# EAGLE design ELRS_USB_TX (EAGLE 9.7.0)

## Sheet 1 of 5: USB-C, protection and USB-UART
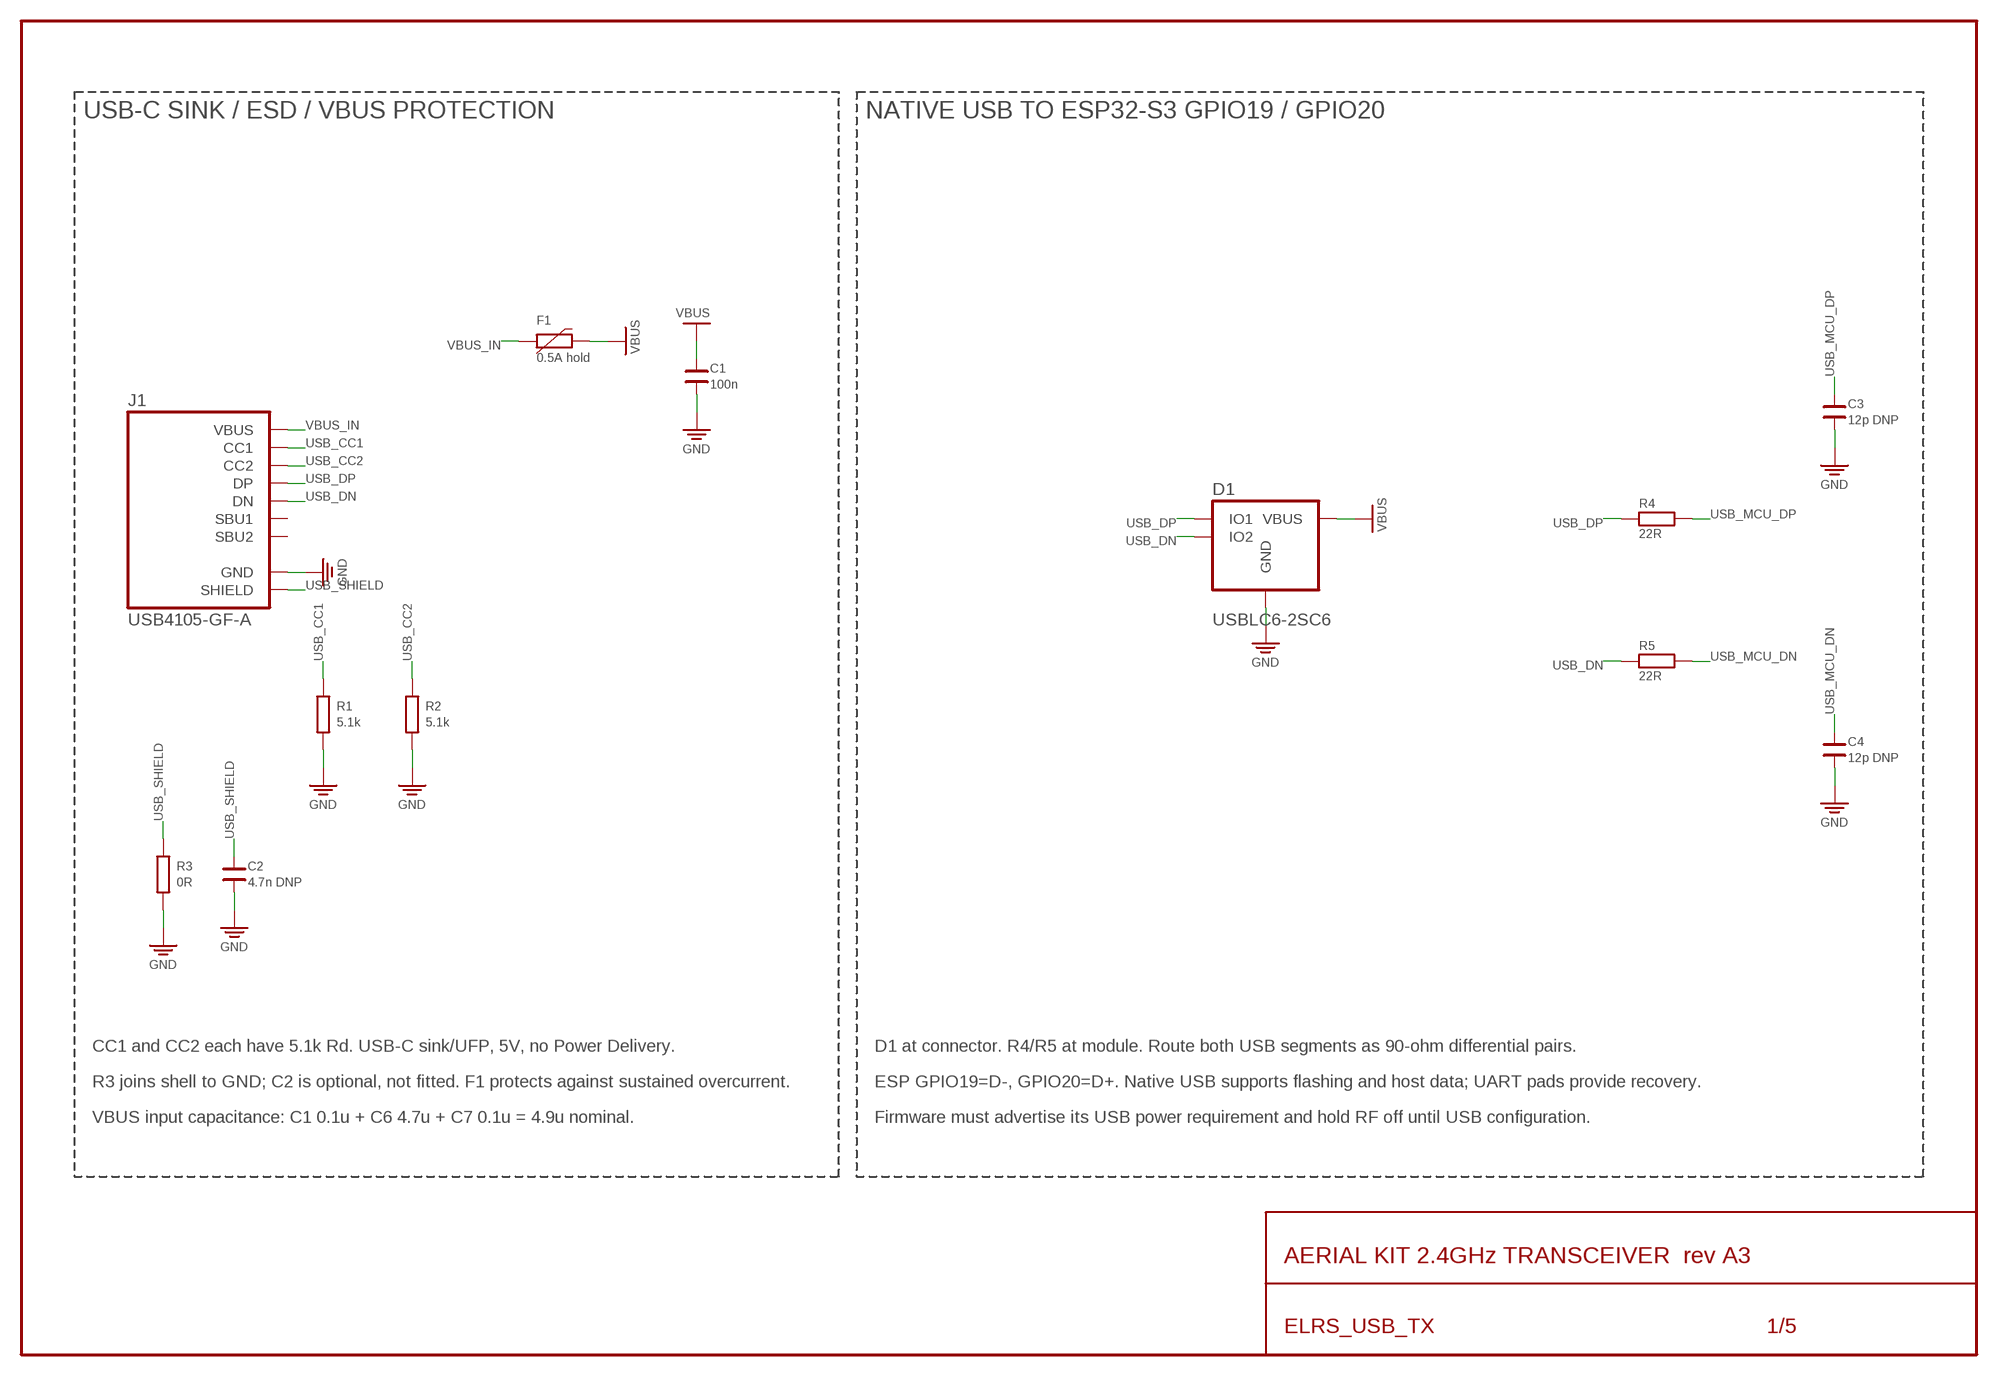
[diagram p0: schematic, sheet 1]

### Parts
C1  100n  C0402  [C0402]
C2  4.7n DNP  C0402  [C0402]
C3  12p DNP  C0402  [C0402]
C4  12p DNP  C0402  [C0402]
D1  USBLC6-2SC6  [SOT23-6]
F1  0.5A hold  PTC0805  [F0805]
J1  USB4105-GF-A  USB_CUSB4105  [USB4105_GF_A]
R1  5.1k  R0402  [R0402]
R2  5.1k  R0402  [R0402]
R3  0R  R0402  [R0402]
R4  22R  R0402  [R0402]
R5  22R  R0402  [R0402]

### Nets
GND [power]: C1.1 C2.1 C3.1 C4.1 D1.2(GND) J1.A1B12(GND) J1.B12A1(GND) R1.1 R2.1 R3.1 ; supply symbol labelled SUP_GND ; also sheet 2,3,4,5
USB_CC1: J1.A5(CC1) R1.2
USB_CC2: J1.B5(CC2) R2.2
USB_DN [usb90]: D1.3(IO2) D1.4(IO2) J1.A7(DN) J1.B7(DN) R5.1
USB_DP [usb90]: D1.1(IO1) D1.6(IO1) J1.A6(DP) J1.B6(DP) R4.1
USB_MCU_DN [usb90]: C4.2 R5.2 ; also sheet 3
USB_MCU_DP [usb90]: C3.2 R4.2 ; also sheet 3
USB_SHIELD: C2.2 J1.S1(SHIELD) J1.S1B(SHIELD) J1.S1T(SHIELD) J1.S2(SHIELD) J1.S2B(SHIELD) J1.S2T(SHIELD) J1.S3(SHIELD) J1.S3B(SHIELD) J1.S3T(SHIELD) J1.S4(SHIELD) J1.S4B(SHIELD) J1.S4T(SHIELD) R3.2
VBUS [power]: C1.2 D1.5(VBUS) F1.2 ; supply symbol labelled SUP_VBUS ; also sheet 2,5
VBUS_IN [power]: F1.1 J1.A4B9(VBUS) J1.B9A4(VBUS)
Unconnected: J1.A8(SBU1) J1.B8(SBU2)

### Notes on the sheet
- USB-C SINK / ESD / VBUS PROTECTION | NATIVE USB TO ESP32-S3 GPIO19 / GPIO20
- CC1 and CC2 each have 5.1k Rd. USB-C sink/UFP, 5V, no Power Delivery. | D1 at connector. R4/R5 at module. Route both USB segments as 90-ohm differential pairs.
- R3 joins shell to GND; C2 is optional, not fitted. F1 protects against sustained overcurrent. | ESP GPIO19=D-, GPIO20=D+. Native USB supports flashing and host data; UART pads provide recovery.
- VBUS input capacitance: C1 0.1u + C6 4.7u + C7 0.1u = 4.9u nominal. | Firmware must advertise its USB power requirement and hold RF off until USB configuration.

## Sheet 2 of 5
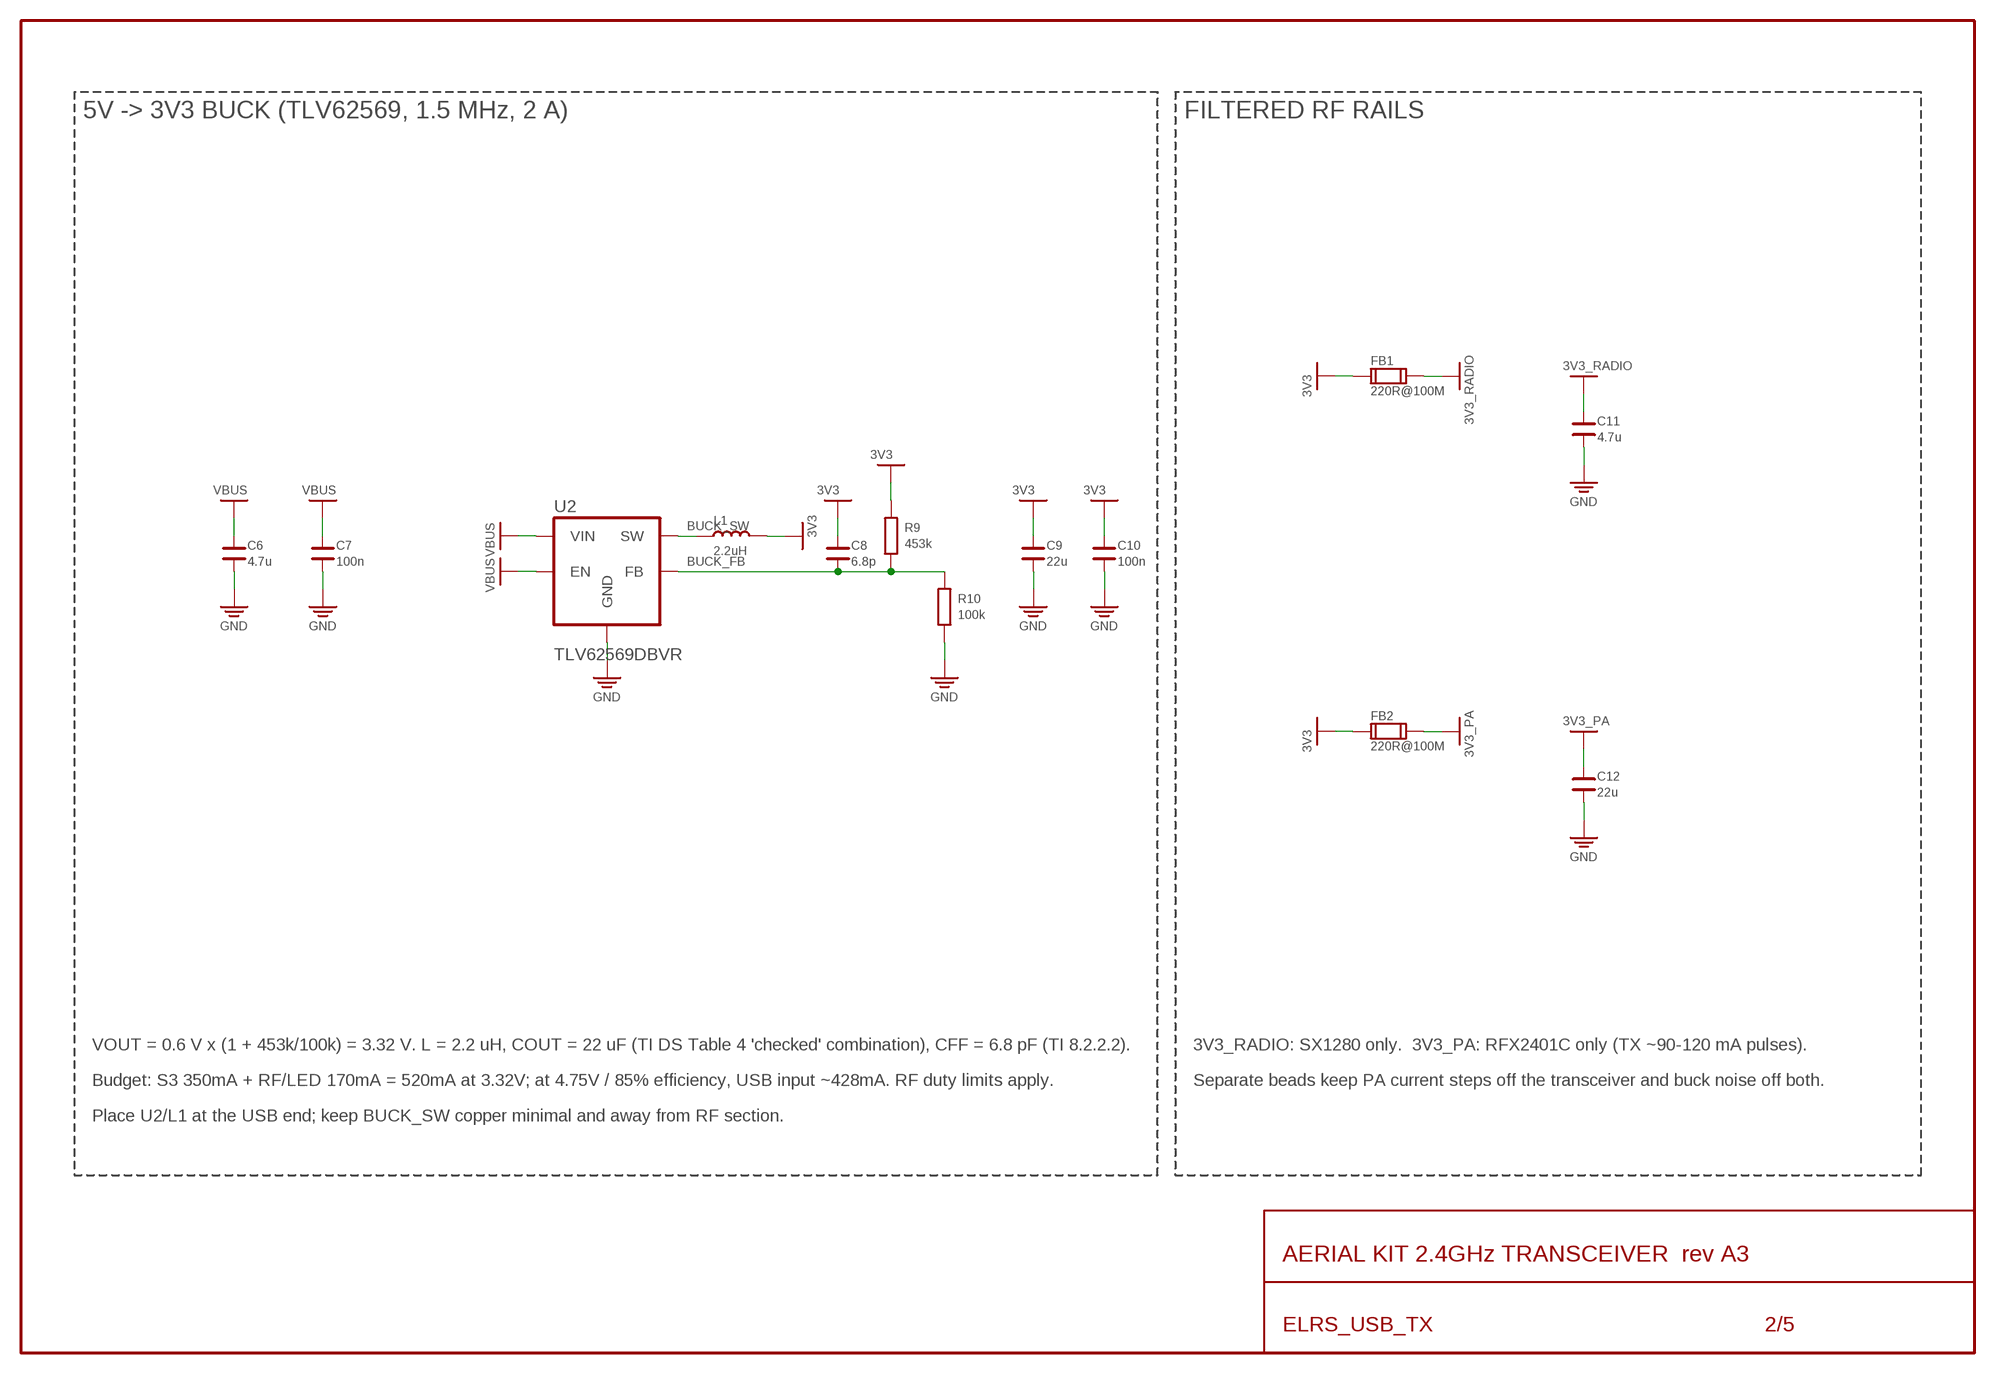
[diagram p1: schematic, sheet 2]

### Parts
C6  4.7u  C0603  [C0603]
C7  100n  C0402  [C0402]
C8  6.8p  C0402  [C0402]
C9  22u  C0805  [C0805]
C10  100n  C0402  [C0402]
C11  4.7u  C0603  [C0603]
C12  22u  C0805  [C0805]
FB1  220R@100M  FB0603  [FB0603]
FB2  220R@100M  FB0603  [FB0603]
L1  2.2uH  LDFE201610  [DFE201610]
R9  453k  R0402  [R0402]
R10  100k  R0402  [R0402]
U2  TLV62569DBVR  TLV62569DBV  [SOT23-5]

### Nets
3V3 [power]: C8.2 C9.2 C10.2 FB1.1 FB2.1 L1.2 R9.2 ; supply symbol labelled SUP_3V3 ; also sheet 3,5
3V3_PA [power]: C12.2 FB2.2 ; supply symbol labelled SUP_3V3_PA ; also sheet 4
3V3_RADIO [power]: C11.2 FB1.2 ; supply symbol labelled SUP_3V3_RADIO ; also sheet 4
BUCK_FB: C8.1 R9.1 R10.2 U2.5(FB)
BUCK_SW [power]: L1.1 U2.3(SW)
GND [power]: C6.1 C7.1 C9.1 C10.1 C11.1 C12.1 R10.1 U2.2(GND) ; supply symbol labelled SUP_GND ; also sheet 1,3,4,5
VBUS [power]: C6.2 C7.2 U2.1(EN) U2.4(VIN) ; supply symbol labelled SUP_VBUS ; also sheet 1,5

### Notes on the sheet
- 5V -> 3V3 BUCK (TLV62569, 1.5 MHz, 2 A) | FILTERED RF RAILS
- VOUT = 0.6 V x (1 + 453k/100k) = 3.32 V. L = 2.2 uH, COUT = 22 uF (TI DS Table 4 'checked' combination), CFF = 6.8 pF (TI 8.2.2.2). | 3V3_RADIO: SX1280 only.  3V3_PA: RFX2401C only (TX ~90-120 mA pulses).
- Budget: S3 350mA + RF/LED 170mA = 520mA at 3.32V; at 4.75V / 85% efficiency, USB input ~428mA. RF duty limits apply. | Separate beads keep PA current steps off the transceiver and buck noise off both.
- Place U2/L1 at the USB end; keep BUCK_SW copper minimal and away from RF section.

## Sheet 3 of 5
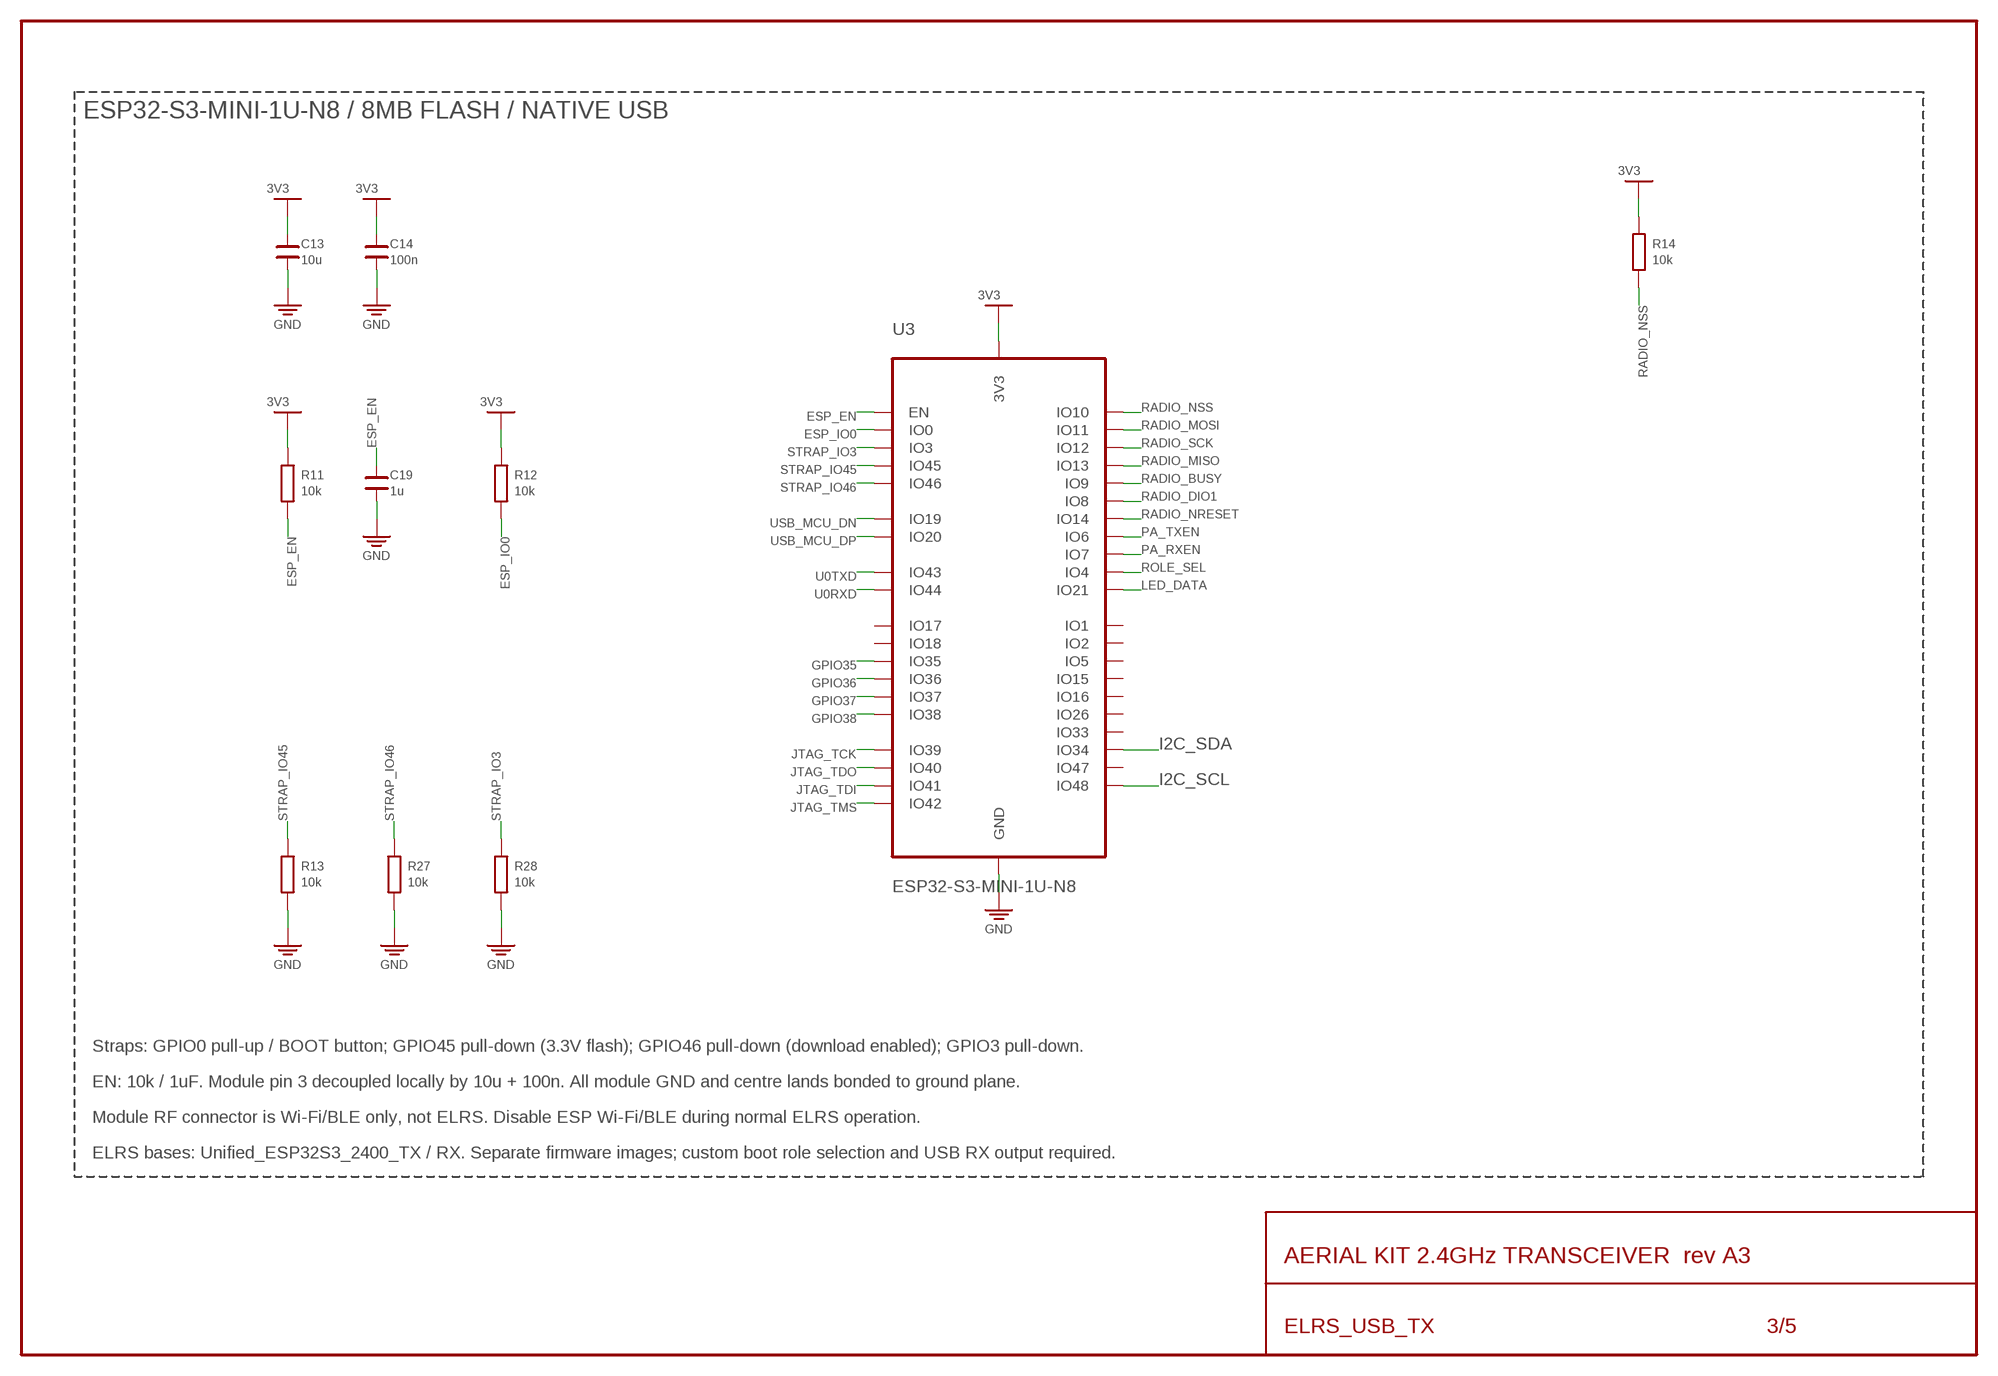
[diagram p2: schematic, sheet 3]

### Parts
C13  10u  C0603  [C0603]
C14  100n  C0402  [C0402]
C19  1u  C0402  [C0402]
R11  10k  R0402  [R0402]
R12  10k  R0402  [R0402]
R13  10k  R0402  [R0402]
R14  10k  R0402  [R0402]
R27  10k  R0402  [R0402]
R28  10k  R0402  [R0402]
U3  ESP32-S3-MINI-1U-N8  ESP32-S3-MINI-1UN8  [ESP32_S3_MINI_1U]

### Nets
3V3 [power]: C13.2 C14.2 R11.2 R12.2 R14.2 U3.3(3V3) ; supply symbol labelled SUP_3V3 ; also sheet 2,5
ESP_EN: C19.2 R11.1 U3.45(EN) ; also sheet 5
ESP_IO0: R12.1 U3.4(IO0) ; also sheet 5
GND [power]: C13.1 C14.1 C19.1 R13.1 R27.1 R28.1 U3.1(GND) U3.2(GND) U3.42(GND) U3.43(GND) U3.46(GND) U3.47(GND) U3.48(GND) U3.49(GND) U3.50(GND) U3.51(GND) U3.52(GND) U3.53(GND) U3.54(GND) U3.55(GND) U3.56(GND) U3.57(GND) U3.58(GND) U3.59(GND) U3.60(GND) U3.61_1(GND) U3.61_2(GND) U3.61_3(GND) U3.61_4(GND) U3.61_5(GND) U3.61_6(GND) U3.61_7(GND) U3.61_8(GND) U3.61_9(GND) U3.62(GND) U3.63(GND) U3.64(GND) U3.65(GND) ; supply symbol labelled SUP_GND ; also sheet 1,2,4,5
GPIO35: U3.31(IO35) ; also sheet 5
GPIO36: U3.32(IO36) ; also sheet 5
GPIO37: U3.33(IO37) ; also sheet 5
GPIO38: U3.34(IO38) ; also sheet 5
I2C_SCL: U3.30(IO48) ; also sheet 5
I2C_SDA: U3.29(IO34) ; also sheet 5
JTAG_TCK: U3.35(IO39) ; also sheet 5
JTAG_TDI: U3.37(IO41) ; also sheet 5
JTAG_TDO: U3.36(IO40) ; also sheet 5
JTAG_TMS: U3.38(IO42) ; also sheet 5
LED_DATA: U3.25(IO21) ; also sheet 5
PA_RXEN: U3.11(IO7) ; also sheet 4,5
PA_TXEN: U3.10(IO6) ; also sheet 4,5
RADIO_BUSY: U3.13(IO9) ; also sheet 4,5
RADIO_DIO1: U3.12(IO8) ; also sheet 4,5
RADIO_MISO: U3.17(IO13) ; also sheet 4
RADIO_MOSI: U3.15(IO11) ; also sheet 4
RADIO_NRESET: U3.18(IO14) ; also sheet 4
RADIO_NSS: R14.1 U3.14(IO10) ; also sheet 4
RADIO_SCK: U3.16(IO12) ; also sheet 4
ROLE_SEL: U3.8(IO4) ; also sheet 5
STRAP_IO3: R28.2 U3.7(IO3)
STRAP_IO45: R13.2 U3.41(IO45)
STRAP_IO46: R27.2 U3.44(IO46)
U0RXD: U3.40(IO44) ; also sheet 5
U0TXD: U3.39(IO43) ; also sheet 5
USB_MCU_DN [usb90]: U3.23(IO19) ; also sheet 1
USB_MCU_DP [usb90]: U3.24(IO20) ; also sheet 1
Unconnected: U3.5(IO1) U3.6(IO2) U3.9(IO5) U3.19(IO15) U3.20(IO16) U3.21(IO17) U3.22(IO18) U3.26(IO26) U3.27(IO47) U3.28(IO33)

### Notes on the sheet
- ESP32-S3-MINI-1U-N8 / 8MB FLASH / NATIVE USB
- Straps: GPIO0 pull-up / BOOT button; GPIO45 pull-down (3.3V flash); GPIO46 pull-down (download enabled); GPIO3 pull-down.
- EN: 10k / 1uF. Module pin 3 decoupled locally by 10u + 100n. All module GND and centre lands bonded to ground plane.
- Module RF connector is Wi-Fi/BLE only, not ELRS. Disable ESP Wi-Fi/BLE during normal ELRS operation.
- ELRS bases: Unified_ESP32S3_2400_TX / RX. Separate firmware images; custom boot role selection and USB RX output required.

## Sheet 4 of 5
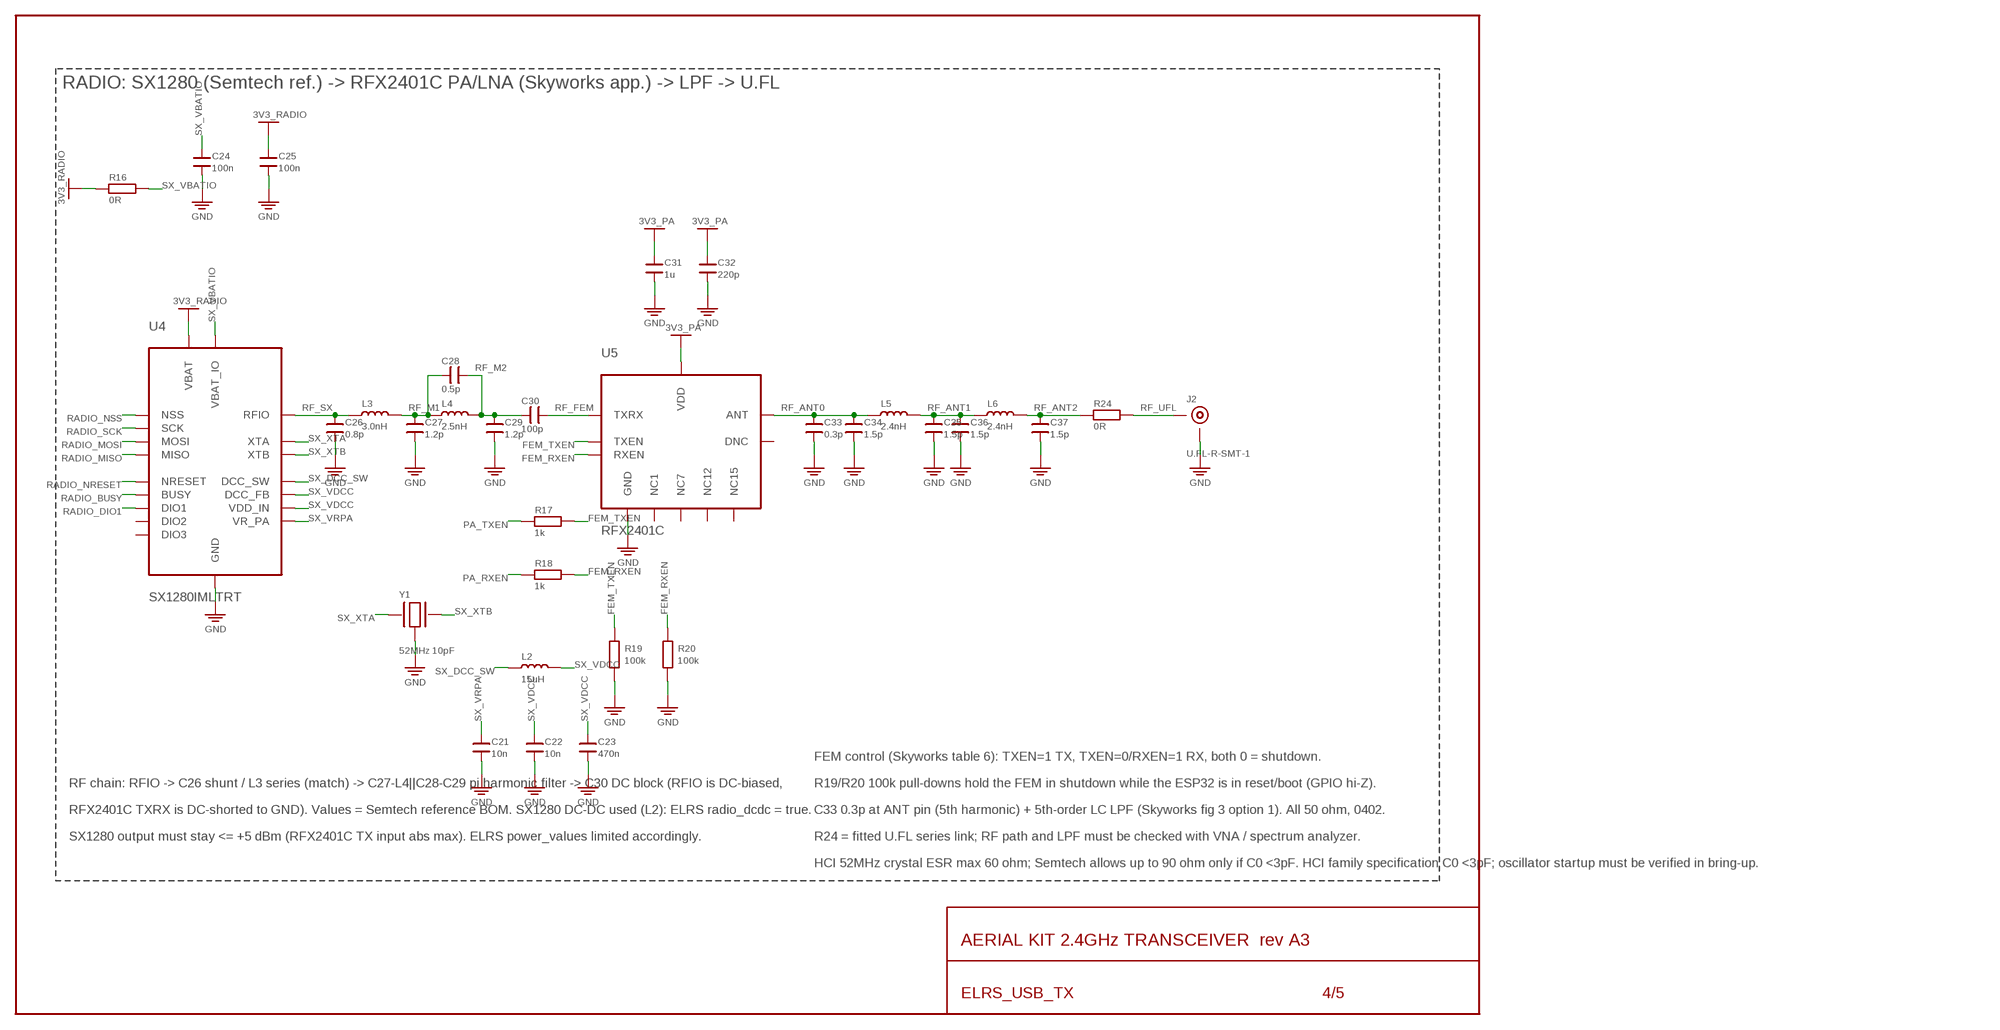
[diagram p3: schematic, sheet 4]

### Parts
C21  10n  C0402  [C0402]
C22  10n  C0402  [C0402]
C23  470n  C0402  [C0402]
C24  100n  C0402  [C0402]
C25  100n  C0402  [C0402]
C26  0.8p  C0402  [C0402]
C27  1.2p  C0402  [C0402]
C28  0.5p  C0402  [C0402]
C29  1.2p  C0402  [C0402]
C30  100p  C0402  [C0402]
C31  1u  C0402  [C0402]
C32  220p  C0402  [C0402]
C33  0.3p  C0402  [C0402]
C34  1.5p  C0402  [C0402]
C35  1.5p  C0402  [C0402]
C36  1.5p  C0402  [C0402]
C37  1.5p  C0402  [C0402]
J2  U.FL-R-SMT-1  UFL  [UFL_R_SMT]
L2  15uH  L0805  [L0805]
L3  3.0nH  L0402  [L0402]
L4  2.5nH  L0402  [L0402]
L5  2.4nH  L0402  [L0402]
L6  2.4nH  L0402  [L0402]
R16  0R  R0402  [R0402]
R17  1k  R0402  [R0402]
R18  1k  R0402  [R0402]
R19  100k  R0402  [R0402]
R20  100k  R0402  [R0402]
R24  0R  R0402  [R0402]
U4  SX1280IMLTRT  SX1280  [QFN24_4X4_SX1280]
U5  RFX2401C  [QFN16_3X3_RFX2401C]
Y1  52MHz 10pF  XTAL2016  [XTAL2016_4P]

### Nets
3V3_PA [power]: C31.2 C32.2 U5.14(VDD) U5.16(VDD) ; supply symbol labelled SUP_3V3_PA ; also sheet 2
3V3_RADIO [power]: C25.2 R16.1 U4.15(VBAT) ; supply symbol labelled SUP_3V3_RADIO ; also sheet 2
FEM_RXEN: R18.2 R20.2 U5.6(RXEN)
FEM_TXEN: R17.2 R19.2 U5.5(TXEN)
GND [power]: C21.1 C22.1 C23.1 C24.1 C25.1 C26.1 C27.1 C29.1 C31.1 C32.1 C33.1 C34.1 C35.1 C36.1 C37.1 J2.GND1(GND) J2.GND2(GND) R19.1 R20.1 U4.5(GND) U4.13(GND) U4.20(GND) U4.21(GND) U4.23(GND) U4.24(GND) U4.25(GND) U5.2(GND) U5.3(GND) U5.8(GND) U5.9(GND) U5.11(GND) U5.17(GND) Y1.2(GND) Y1.4(GND) ; supply symbol labelled SUP_GND ; also sheet 1,2,3,5
PA_RXEN: R18.1 ; also sheet 3,5
PA_TXEN: R17.1 ; also sheet 3,5
RADIO_BUSY: U4.7(BUSY) ; also sheet 3,5
RADIO_DIO1: U4.8(DIO1) ; also sheet 3,5
RADIO_MISO: U4.16(MISO) ; also sheet 3
RADIO_MOSI: U4.17(MOSI) ; also sheet 3
RADIO_NRESET: U4.3(NRESET) ; also sheet 3
RADIO_NSS: U4.19(NSS) ; also sheet 3
RADIO_SCK: U4.18(SCK) ; also sheet 3
RF_ANT0 [rf50]: C33.2 C34.2 L5.1 U5.10(ANT)
RF_ANT1 [rf50]: C35.2 C36.2 L5.2 L6.1
RF_ANT2 [rf50]: C37.2 L6.2 R24.1
RF_FEM [rf50]: C30.2 U5.4(TXRX)
RF_M1 [rf50]: C27.2 C28.1 L3.2 L4.1
RF_M2 [rf50]: C28.2 C29.2 C30.1 L4.2
RF_SX [rf50]: C26.2 L3.1 U4.22(RFIO)
RF_UFL [rf50]: J2.SIG R24.2
SX_DCC_SW: L2.1 U4.14(DCC_SW)
SX_VBATIO: C24.2 R16.2 U4.11(VBAT_IO)
SX_VDCC: C22.2 C23.2 L2.2 U4.2(VDD_IN) U4.12(DCC_FB)
SX_VRPA: C21.2 U4.1(VR_PA)
SX_XTA: U4.4(XTA) Y1.1(X1)
SX_XTB: U4.6(XTB) Y1.3(X2)
Unconnected: U4.9(DIO2) U4.10(DIO3) U5.1(NC1) U5.7(NC7) U5.12(NC12) U5.13(DNC) U5.15(NC15)

### Notes on the sheet
- RADIO: SX1280 (Semtech ref.) -> RFX2401C PA/LNA (Skyworks app.) -> LPF -> U.FL
- FEM control (Skyworks table 6): TXEN=1 TX, TXEN=0/RXEN=1 RX, both 0 = shutdown.
- RF chain: RFIO -> C26 shunt / L3 series (match) -> C27-L4||C28-C29 pi harmonic filter -> C30 DC block (RFIO is DC-biased, | R19/R20 100k pull-downs hold the FEM in shutdown while the ESP32 is in reset/boot (GPIO hi-Z).
- RFX2401C TXRX is DC-shorted to GND). Values = Semtech reference BOM. SX1280 DC-DC used (L2): ELRS radio_dcdc = true. | C33 0.3p at ANT pin (5th harmonic) + 5th-order LC LPF (Skyworks fig 3 option 1). All 50 ohm, 0402.
- SX1280 output must stay <= +5 dBm (RFX2401C TX input abs max). ELRS power_values limited accordingly. | R24 = fitted U.FL series link; RF path and LPF must be checked with VNA / spectrum analyzer.
- HCI 52MHz crystal ESR max 60 ohm; Semtech allows up to 90 ohm only if C0 <3pF. HCI family specification C0 <3pF; oscillator startup must be verified in bring-up.

## Sheet 5 of 5
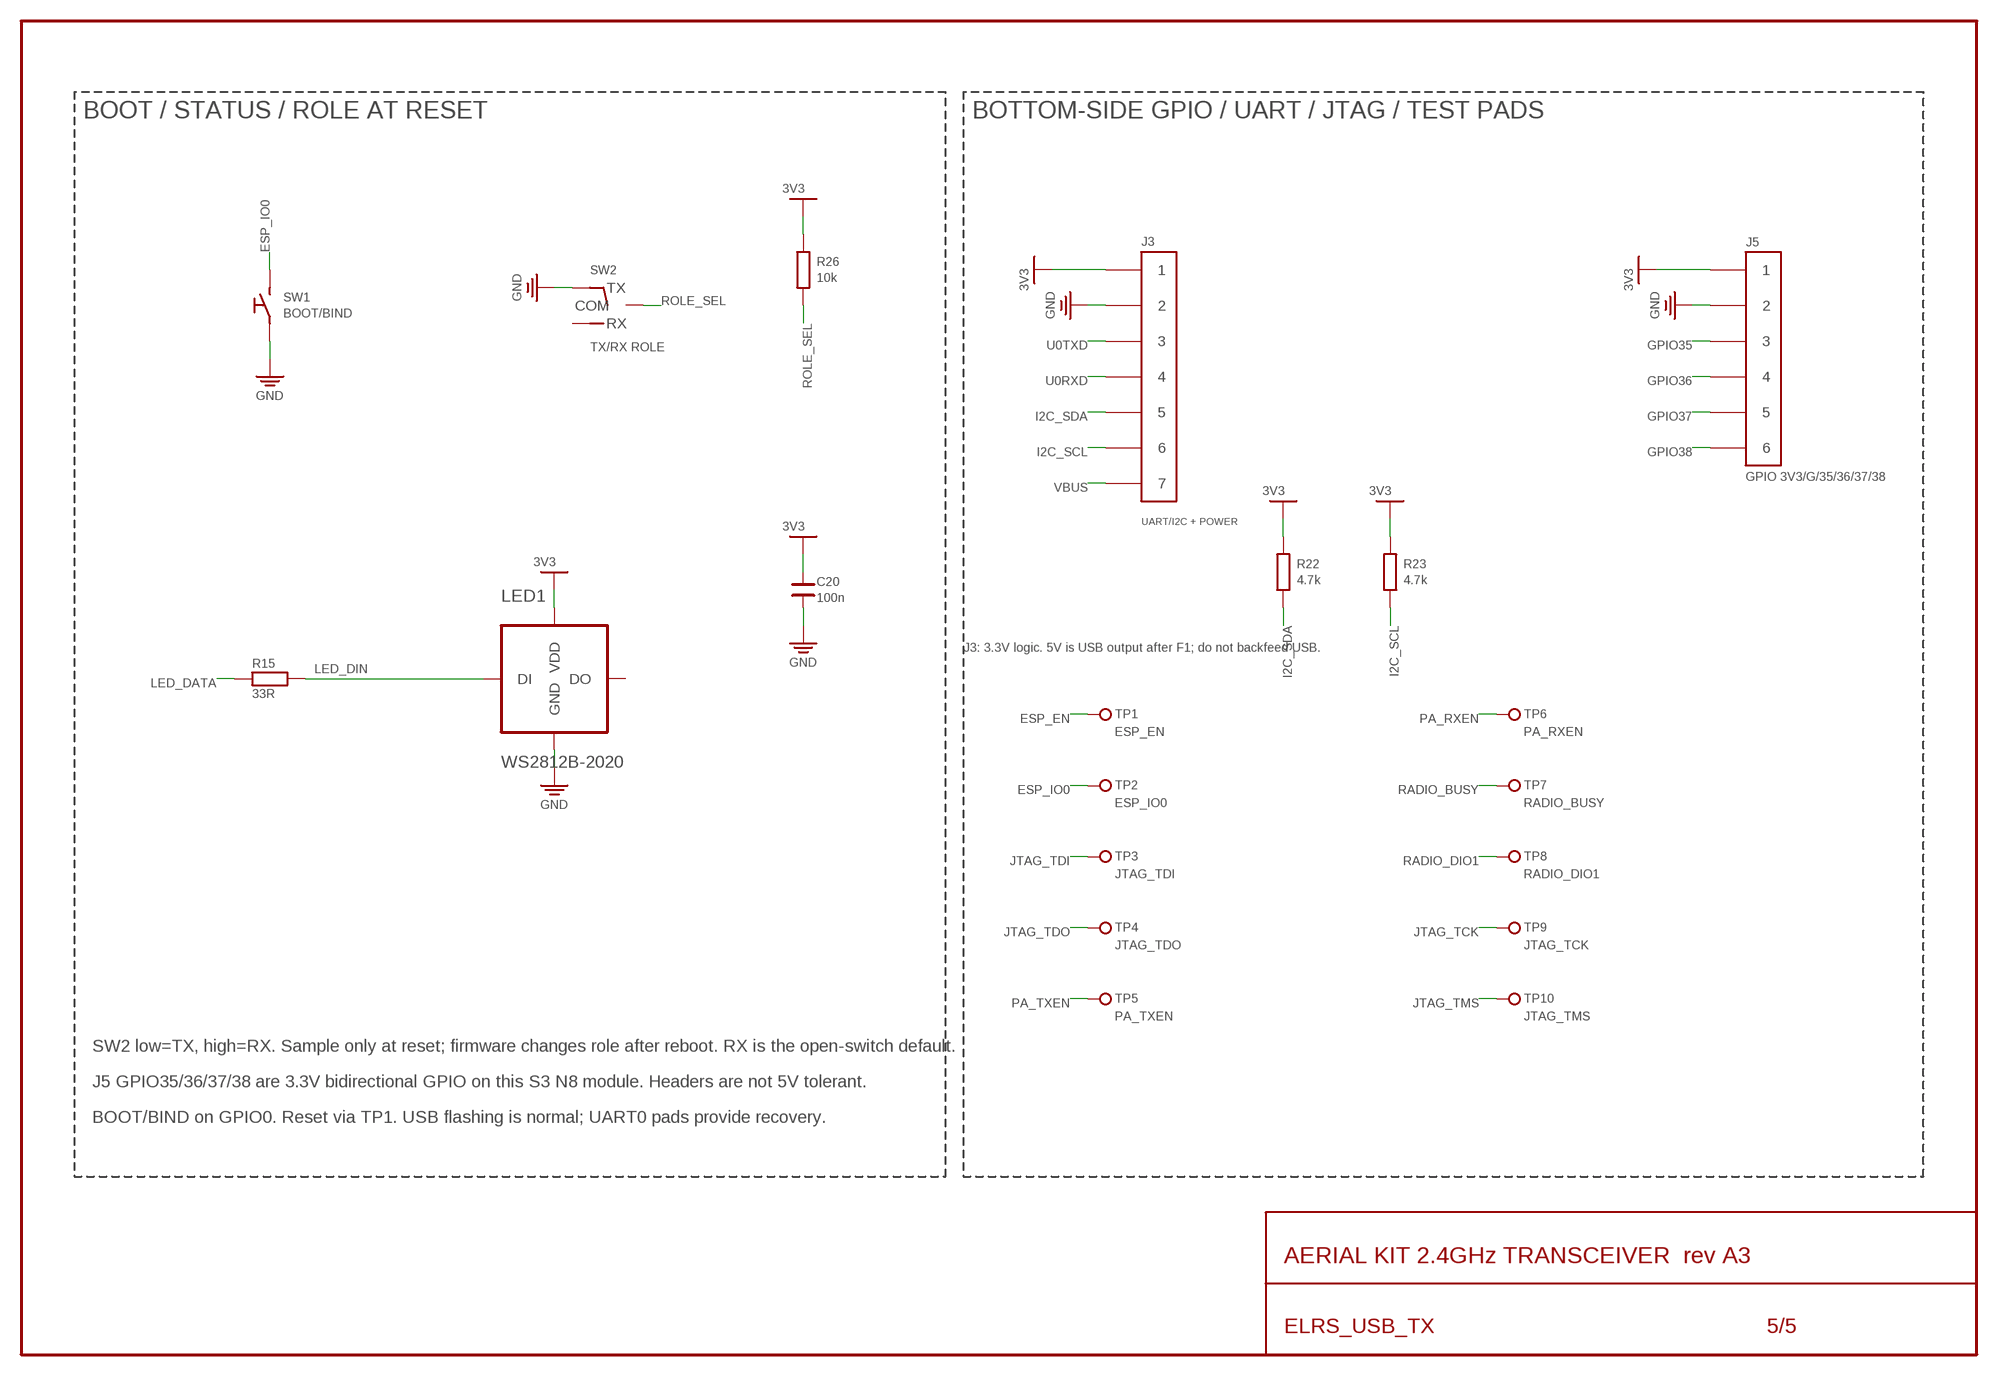
[diagram p4: schematic, sheet 5]

### Parts
C20  100n  C0402  [C0402]
J3  UART/I2C + POWER  HDR7  [PADS7_1P5]
J5  GPIO 3V3/G/35/36/37/38  HDR6  [PADS6_1P5]
LED1  WS2812B-2020  WS2812B2020  [LED2020_WS2812B]
R15  33R  R0402  [R0402]
R22  4.7k  R0402  [R0402]
R23  4.7k  R0402  [R0402]
R26  10k  R0402  [R0402]
SW1  BOOT/BIND  SWTS1088  [SW_TS1088]
SW2  TX/RX ROLE  SW_SPDTSSSS810701  [SW_SSSS810701]
TP1  ESP_EN  TP  [TP_1MM]
TP2  ESP_IO0  TP  [TP_1MM]
TP3  JTAG_TDI  TP  [TP_1MM]
TP4  JTAG_TDO  TP  [TP_1MM]
TP5  PA_TXEN  TP  [TP_1MM]
TP6  PA_RXEN  TP  [TP_1MM]
TP7  RADIO_BUSY  TP  [TP_1MM]
TP8  RADIO_DIO1  TP  [TP_1MM]
TP9  JTAG_TCK  TP  [TP_1MM]
TP10  JTAG_TMS  TP  [TP_1MM]

### Nets
3V3 [power]: C20.2 J3.1 J5.1 LED1.4(VDD) R22.2 R23.2 R26.2 ; supply symbol labelled SUP_3V3 ; also sheet 2,3
ESP_EN: TP1.1(TP) ; also sheet 3
ESP_IO0: SW1.2 TP2.1(TP) ; also sheet 3
GND [power]: C20.1 J3.2 J5.2 LED1.2(GND) SW1.1 SW2.1(TX) ; supply symbol labelled SUP_GND ; also sheet 1,2,3,4
GPIO35: J5.3 ; also sheet 3
GPIO36: J5.4 ; also sheet 3
GPIO37: J5.5 ; also sheet 3
GPIO38: J5.6 ; also sheet 3
I2C_SCL: J3.6 R23.1 ; also sheet 3
I2C_SDA: J3.5 R22.1 ; also sheet 3
JTAG_TCK: TP9.1(TP) ; also sheet 3
JTAG_TDI: TP3.1(TP) ; also sheet 3
JTAG_TDO: TP4.1(TP) ; also sheet 3
JTAG_TMS: TP10.1(TP) ; also sheet 3
LED_DATA: R15.1 ; also sheet 3
LED_DIN: LED1.3(DI) R15.2
PA_RXEN: TP6.1(TP) ; also sheet 3,4
PA_TXEN: TP5.1(TP) ; also sheet 3,4
RADIO_BUSY: TP7.1(TP) ; also sheet 3,4
RADIO_DIO1: TP8.1(TP) ; also sheet 3,4
ROLE_SEL: R26.1 SW2.2(COM) ; also sheet 3
U0RXD: J3.4 ; also sheet 3
U0TXD: J3.3 ; also sheet 3
VBUS [power]: J3.7 ; also sheet 1,2
Unconnected: LED1.1(DO) SW2.3(RX)

### Notes on the sheet
- BOOT / STATUS / ROLE AT RESET | BOTTOM-SIDE GPIO / UART / JTAG / TEST PADS
- J3: 3.3V logic. 5V is USB output after F1; do not backfeed USB.
- SW2 low=TX, high=RX. Sample only at reset; firmware changes role after reboot. RX is the open-switch default.
- J5 GPIO35/36/37/38 are 3.3V bidirectional GPIO on this S3 N8 module. Headers are not 5V tolerant.
- BOOT/BIND on GPIO0. Reset via TP1. USB flashing is normal; UART0 pads provide recovery.

## Library data of the parts
C1 C7 C10 C14 C20 C24 C25 = elrs_usb_tx:C: Ceramic capacitor; LCSC: C1525; MFR: Samsung; MPN: CL05B104KO5NNNC
C2 = elrs_usb_tx:C: Ceramic capacitor; DNP: yes; LCSC: C84705; MFR: Samsung; MPN: CL05B472KB5NNNC
C3 C4 = elrs_usb_tx:C: Ceramic capacitor; DNP: yes; LCSC: C76948; MFR: Murata; MPN: GRM1555C1H120JA01D
C6 C11 = elrs_usb_tx:C: Ceramic capacitor; LCSC: C19666; MFR: Samsung; MPN: CL10A475KO8NNNC
C8 = elrs_usb_tx:C: Ceramic capacitor; LCSC: C237286; MFR: Murata; MPN: GRM1555C1H6R8DA01D
C9 C12 = elrs_usb_tx:C: Ceramic capacitor; LCSC: C45783; MFR: Samsung; MPN: CL21A226MAQNNNE
C13 = elrs_usb_tx:C: Ceramic capacitor; LCSC: C19702; MFR: Samsung; MPN: CL10A106KP8NNNC
C19 C31 = elrs_usb_tx:C: Ceramic capacitor; LCSC: C52923; MFR: Samsung; MPN: CL05A105KA5NQNC
C21 C22 = elrs_usb_tx:C: Ceramic capacitor; LCSC: C15195; MFR: Samsung; MPN: CL05B103KB5NNNC
C23 = elrs_usb_tx:C: Ceramic capacitor; LCSC: C77003; MFR: Murata; MPN: GRM155R61A474KE15D
C26 = elrs_usb_tx:C: Ceramic capacitor; LCSC: C76988; MFR: Murata; MPN: GRM1555C1HR80BA01D; NOTE: C0G RF, place per layout
C27 C29 = elrs_usb_tx:C: Ceramic capacitor; LCSC: C76955; MFR: Murata; MPN: GRM1555C1H1R2CA01D; NOTE: C0G RF, place per layout
C28 = elrs_usb_tx:C: Ceramic capacitor; LCSC: C77179; MFR: Murata; MPN: GRM1555C1HR50BA01D; NOTE: C0G RF, place per layout
C30 = elrs_usb_tx:C: Ceramic capacitor; LCSC: C77177; MFR: Murata; MPN: GRM1555C1H101JA01D; NOTE: C0G RF, place per layout
C32 = elrs_usb_tx:C: Ceramic capacitor; LCSC: C307445; MFR: Samsung; MPN: CL05C221JB5NNNC
C33 = elrs_usb_tx:C: Ceramic capacitor; LCSC: C92338; MFR: Murata; MPN: GRM1555C1HR30WA01D; NOTE: C0G RF, place per layout
C34-C37 = elrs_usb_tx:C: Ceramic capacitor; LCSC: C76957; MFR: Murata; MPN: GRM1555C1H1R5BA01D; NOTE: C0G RF, place per layout
D1 = elrs_usb_tx:USBLC6-2: ST USBLC6-2SC6 USB ESD protection. Pins 1&6 = I/O1, 3&4 = I/O2 (flow-through), 2 GND, 5 VBUS; LCSC: C7519; MFR: ST; MPN: USBLC6-2SC6
F1 = elrs_usb_tx:PTC: PTC resettable fuse; LCSC: C207022; MFR: Littelfuse; MPN: 0805L050WR
FB1 FB2 = elrs_usb_tx:FB: Ferrite bead; LCSC: C80165; MFR: Murata; MPN: BLM18PG221SN1D
J1 = elrs_usb_tx:USB_C: USB 2.0 Type-C receptacle (UFP). A6/B6 = D+, A7/B7 = D-; LCSC: C3020560; MFR: GCT; MPN: USB4105-GF-A
J2 = elrs_usb_tx:UFL: Hirose U.FL receptacle; LCSC: C88374; MFR: Hirose; MPN: U.FL-R-SMT-1(80)
J3 = elrs_usb_tx:HDR7: Combined UART/I2C dual-supply solder pads; LCSC: -; MFR: -; MPN: bare pads
J5 = elrs_usb_tx:HDR6: 6-way GPIO solder pad header; LCSC: -; MFR: -; MPN: bare pads
L1 = elrs_usb_tx:L: Inductor; LCSC: C337891; MFR: Murata; MPN: DFE201610E-2R2M=P2
L2 = elrs_usb_tx:L: Inductor; LCSC: C383402; MFR: TDK; MPN: MLZ2012M150WT000
L3 = elrs_usb_tx:L: Inductor; LCSC: C2041661; MFR: Murata; MPN: LQW15AN3N0B80D
L4 = elrs_usb_tx:L: Inductor; LCSC: C703121; MFR: Murata; MPN: LQW15AN2N5C00D
L5 L6 = elrs_usb_tx:L: Inductor; LCSC: C3911311; MFR: Murata; MPN: LQG15HN2N4B02D
LED1 = elrs_usb_tx:WS2812B: Addressable RGB LED, 3.3-5.3 V (V6); LCSC: C52917434; MFR: Worldsemi; MPN: WS2812B-2020-V6
R1 R2 = elrs_usb_tx:R: Chip resistor; LCSC: C25905; MFR: UNI-ROYAL; MPN: 0402WGF5101TCE
R3 R16 = elrs_usb_tx:R: Chip resistor; LCSC: C17168; MFR: UNI-ROYAL; MPN: 0402WGF0000TCE
R4 R5 = elrs_usb_tx:R: Chip resistor; LCSC: C25092; MFR: UNI-ROYAL; MPN: 0402WGF220JTCE
R9 = elrs_usb_tx:R: Chip resistor; LCSC: C27009; MFR: UNI-ROYAL; MPN: 0402WGF4533TCE
R10 R19 R20 = elrs_usb_tx:R: Chip resistor; LCSC: C25741; MFR: UNI-ROYAL; MPN: 0402WGF1003TCE
R11-R14 R26-R28 = elrs_usb_tx:R: Chip resistor; LCSC: C25744; MFR: UNI-ROYAL; MPN: 0402WGF1002TCE
R15 = elrs_usb_tx:R: Chip resistor; LCSC: C25105; MFR: UNI-ROYAL; MPN: 0402WGF330JTCE
R17 R18 = elrs_usb_tx:R: Chip resistor; LCSC: C11702; MFR: UNI-ROYAL; MPN: 0402WGF1001TCE
R22 R23 = elrs_usb_tx:R: Chip resistor; LCSC: C25900; MFR: UNI-ROYAL; MPN: 0402WGF4701TCE
R24 = elrs_usb_tx:R: Chip resistor; LCSC: C17168; MFR: UNI-ROYAL; MPN: 0402WGF0000TCE; NOTE: U.FL series link / measurement isolation
SW1 = elrs_usb_tx:SW: SPST tact switch; LCSC: C455280; MFR: XUNPU; MPN: TS-1088R-02026
SW2 = elrs_usb_tx:SW_SPDT: Two-position boot role select; LCSC: C97433; MFR: Alps Alpine; MPN: SSSS810701
TP1-TP10 = elrs_usb_tx:TP: Test pad; LCSC: -; MFR: -; MPN: bare pad
U2 = elrs_usb_tx:TLV62569: TI TLV62569 2 A 1.5 MHz sync buck, SOT-23-5: 1 EN, 2 GND, 3 SW, 4 VIN, 5 FB; LCSC: C141836; MFR: TI; MPN: TLV62569DBVR
U3 = elrs_usb_tx:ESP32-S3-MINI-1U: Espressif ESP32-S3-MINI-1U-N8: 8 MB flash, no PSRAM, native USB. Module antenna connector is ESP Wi-Fi/BLE only.; LCSC: C2980299; MFR: Espressif; MPN: ESP32-S3-MINI-1U-N8
U4 = elrs_usb_tx:SX1280: Semtech SX1280 2.4 GHz LoRa/FLRC transceiver; LCSC: C125969; MFR: Semtech; MPN: SX1280IMLTRT
U5 = elrs_usb_tx:RFX2401C: Skyworks RFX2401C 2.4 GHz PA/LNA/TR-switch FEM; LCSC: C19213; MFR: Skyworks; MPN: RFX2401C
Y1 = elrs_usb_tx:XTAL: 4-pad SMD crystal, pads 2/4 to lid; LCSC: C3034316; MFR: HCI; MPN: XC21M4-52.000-F10NNHPL; NOTE: 52 MHz, CL 10 pF, +-10 ppm tol/stab, ESR<=60R, 2016 4-pad (#1/#3 xtal). Alt: NDK NX2016SA-52M-EXS00A-CS07103 (C6249276)

## Net classes
0 default: width 0.15 mm, drill 0.2 mm
1 power: width 0.25 mm, drill 0.2 mm
2 rf50: width 0.2 mm, drill 0.3 mm
3 usb90: width 0.2 mm, drill 0.2 mm

## Board
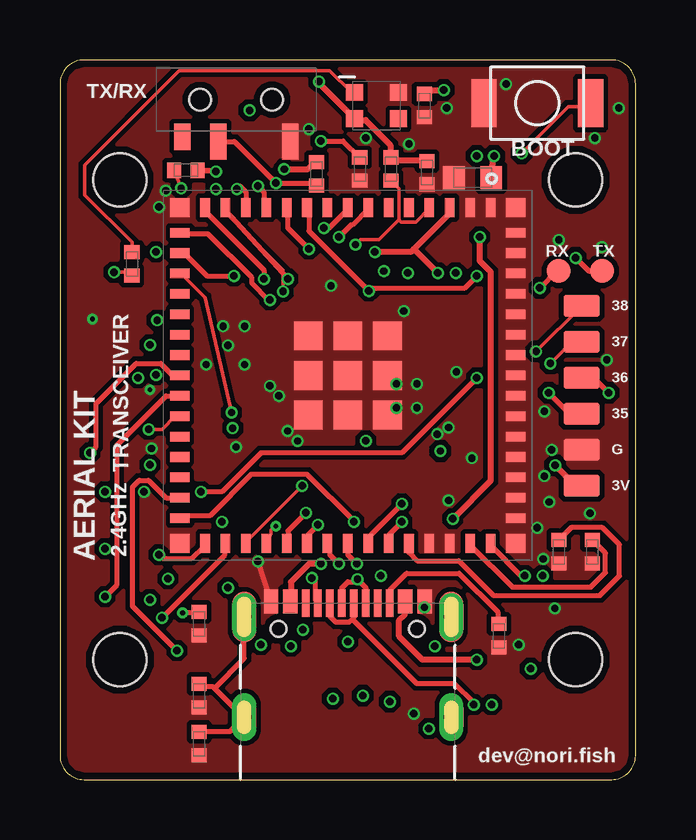
[diagram p5: board, top side]
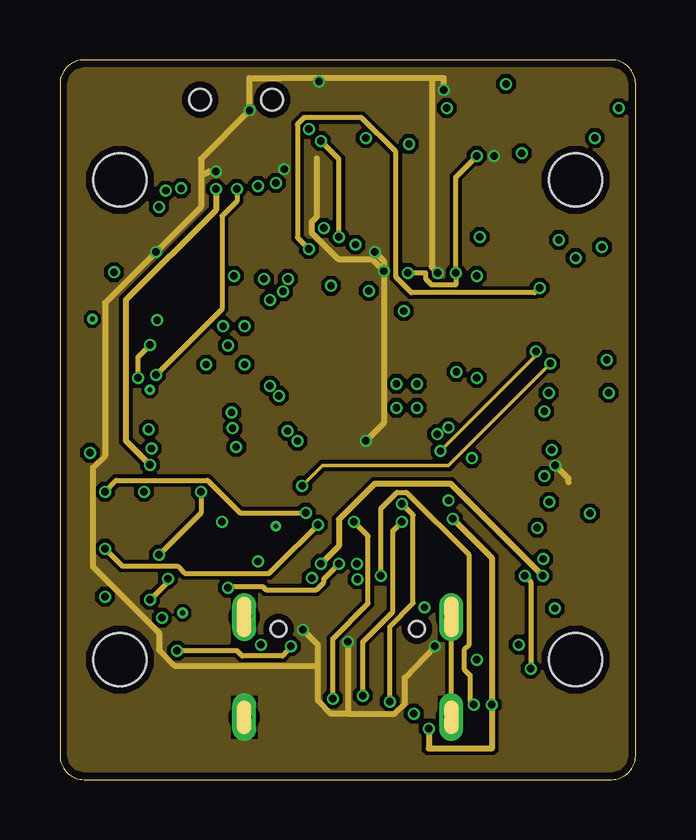
[diagram p6: board, inner layer Route2]
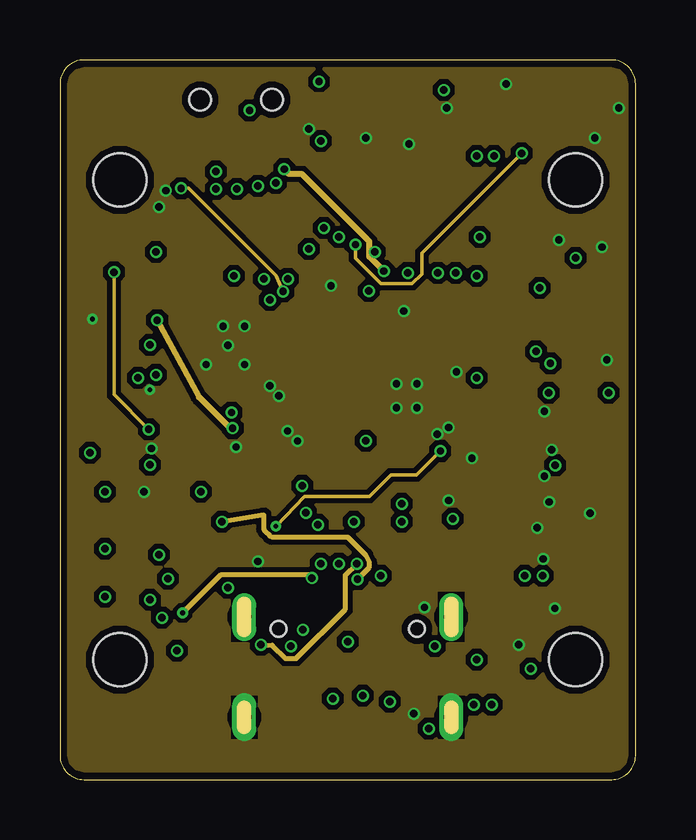
[diagram p7: board, inner layer Route15]
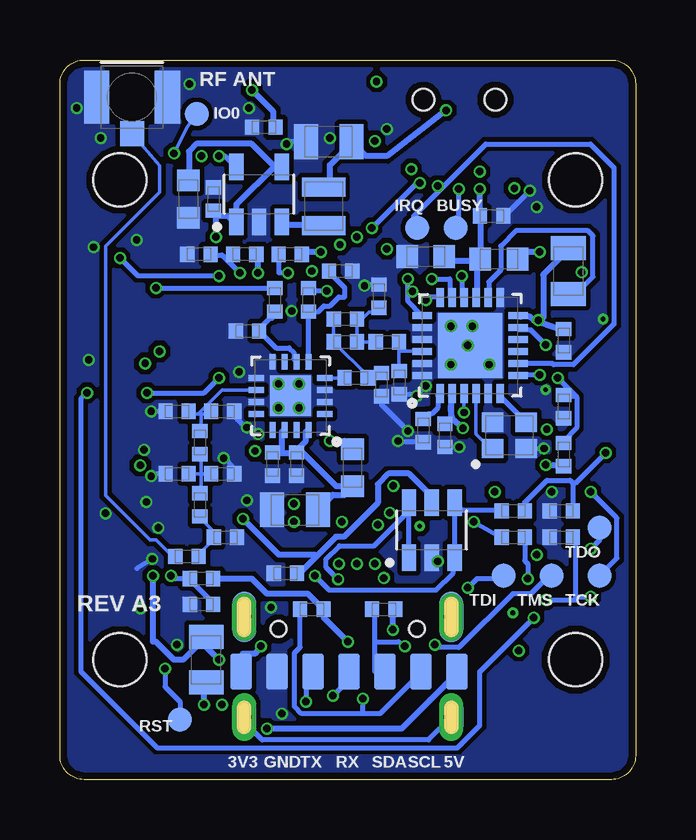
[diagram p8: board, bottom side, seen from below]

Size 24 x 30 mm. Coordinates in mm from the lower left corner, seen from the top.
Outline: 1,0 23,0 arc90 24,1 24,29 arc90 23,30 1,30 arc90 0,29 0,1 arc90 1,0
Copper layers (1*2*15*16): Top / Route2 / Route15 / Bottom
Stack-up Default Layer Stack: Top User Defined 0.035mm / Dielectric-2 User Defined 0.0994mm / Route2 User Defined 0.0152mm / Dielectric-1 User Defined 1.265mm / Route15 User Defined 0.0152mm / Dielectric-3 User Defined 0.2mm / Bottom User Defined 0.035mm
Design rules: minimum copper width class=1 0.25mm, minimum copper width class=2 0.2mm, minimum copper width class=3 0.2mm, minimum copper width class=0 0.15mm, minimum copper width 5mil, minimum drill size class=2 0.3mm, minimum drill size class=1 0.2mm, minimum drill size class=3 0.2mm, minimum drill size class=0 0.2mm, minimum drill size 0.2mm, copper clearance wire_polygon to wire_polygon 5mil, copper clearance wire_polygon to pad_smd 5mil, copper clearance wire_polygon to via 5mil, copper clearance pad_smd to pad_smd 5mil, copper clearance pad_smd to via 5mil, copper clearance via to via 5mil, copper clearance smd to pad (same net) 5mil, copper clearance smd to via (same net) 5mil, copper clearance smd to smd (same net) 5mil, dimension clearance 0.3mm, via restrict clearance 0mil, restrict clearance 0mil, drill distance 0.25mm, keepout clearance 0mil
Holes 2.2 mm at 2.5,5 21.5,5 2.5,25 21.5,25

### Footprints (pad centres in the part's own frame; a part is rotated, then mirrored left to right if it is on the bottom)
C0402 = smd 0.59 x 0.64: 1 -0.485,0; 2 0.485,0
C0603 = smd 0.9 x 0.95: 1 -0.775,0; 2 0.775,0
C0805 = smd 1 x 1.45: 1 -0.95,0; 2 0.95,0
SOT23-6 = smd 0.6 x 1.1: 1 -0.95,-1.15; 2 0,-1.15; 3 0.95,-1.15; 4 0.95,1.15; 5 0,1.15; 6 -0.95,1.15
F0805 = smd 1 x 1.45: 1 -0.95,0; 2 0.95,0
FB0603 = smd 0.9 x 0.95: 1 -0.775,0; 2 0.775,0
USB4105_GF_A = smd 0.6 x 1: A1B12 -3.2,7.43; A4B9 -2.4,7.43; B9A4 2.4,7.43; B12A1 3.2,7.43 | smd 0.3 x 1.15: A5 -1.25,7.355; A6 -0.25,7.355; A7 0.25,7.355; A8 1.25,7.355; B5 1.75,7.355; B6 0.75,7.355; B7 -0.75,7.355; B8 -1.75,7.355 | drill 0.6 pad 1 long: S1 -4.32,2.6; S2 4.32,2.6; S3 -4.32,6.78; S4 4.32,6.78 | smd 1 x 1.8 bottom: S1B -4.32,2.6; S2B 4.32,2.6 | smd 1 x 1.8: S1T -4.32,2.6; S2T 4.32,2.6 | smd 1 x 2.1 bottom: S3B -4.32,6.78; S4B 4.32,6.78 | smd 1 x 2.1: S3T -4.32,6.78; S4T 4.32,6.78 | hole 0.65: -2.89,6.28; 2.89,6.28
UFL_R_SMT = smd 1.05 x 2.2: GND1 -1.475,0; GND2 1.475,0 | smd 1 x 1.05: SIG 0,-1.525
PADS7_1P5 = smd 0.9 x 1.5: 1 -4.5,0; 2 -3,0; 3 -1.5,0; 4 0,0; 5 1.5,0; 6 3,0; 7 4.5,0
PADS6_1P5 = smd 0.9 x 1.5: 1 -3.75,0; 2 -2.25,0; 3 -0.75,0; 4 0.75,0; 5 2.25,0; 6 3.75,0
DFE201610 = smd 0.8 x 1.8: 1 -0.8,0; 2 0.8,0
L0805 = smd 1 x 1.45: 1 -0.95,0; 2 0.95,0
L0402 = smd 0.59 x 0.64: 1 -0.485,0; 2 0.485,0
LED2020_WS2812B = smd 0.7 x 0.7: 1 0.915,-0.55; 2 0.915,0.55; 3 -0.915,0.55; 4 -0.915,-0.55
R0402 = smd 0.59 x 0.64: 1 -0.485,0; 2 0.485,0
SW_TS1088 = smd 1.05 x 2: 1 -2.225,0; 2 2.225,0
SW_SSSS810701 = smd 0.7 x 1.5: 1 -2.25,1.75; 2 0.75,1.75 | smd 0.7 x 1.1: 3 2.25,1.55 | hole 0.9: -1.5,0; 1.5,0
TP_1MM = smd 1 x 1: 1 0,0
SOT23-5 = smd 0.6 x 1.1: 1 -0.95,-1.15; 2 0,-1.15; 3 0.95,-1.15; 4 0.95,1.15; 5 -0.95,1.15
ESP32_S3_MINI_1U = smd 0.8 x 0.4: 1 -7,5.95; 2 -7,5.1; 3 -7,4.25; 4 -7,3.4; 5 -7,2.55; 6 -7,1.7; 7 -7,0.85; 8 -7,0; 9 -7,-0.85; 10 -7,-1.7; 11 -7,-2.55; 12 -7,-3.4; 13 -7,-4.25; 14 -7,-5.1; 15 -7,-5.95; 31 7,-5.95; 32 7,-5.1; 33 7,-4.25; 34 7,-3.4; 35 7,-2.55; 36 7,-1.7; 37 7,-0.85; 38 7,0; 39 7,0.85; 40 7,1.7; 41 7,2.55; 42 7,3.4; 43 7,4.25; 44 7,5.1; 45 7,5.95 | smd 0.4 x 0.8: 16 -5.95,-7; 17 -5.1,-7; 18 -4.25,-7; 19 -3.4,-7; 20 -2.55,-7; 21 -1.7,-7; 22 -0.85,-7; 23 0,-7; 24 0.85,-7; 25 1.7,-7; 26 2.55,-7; 27 3.4,-7; 28 4.25,-7; 29 5.1,-7; 30 5.95,-7; 46 5.95,7; 47 5.1,7; 48 4.25,7; 49 3.4,7; 50 2.55,7; 51 1.7,7; 52 0.85,7; 53 0,7; 54 -0.85,7; 55 -1.7,7; 56 -2.55,7; 57 -3.4,7; 58 -4.25,7; 59 -5.1,7; 60 -5.95,7 | smd 1.2 x 1.2: 61_1 -1.65,1.65; 61_2 -1.65,0; 61_3 -1.65,-1.65; 61_4 0,1.65; 61_5 0,0; 61_6 0,-1.65; 61_7 1.65,1.65; 61_8 1.65,0; 61_9 1.65,-1.65 | smd 0.8 x 0.8: 62 -7,7; 63 -7,-7; 64 7,-7; 65 7,7
QFN24_4X4_SX1280 = smd 0.8 x 0.3: 1 -2,1.25; 2 -2,0.75; 3 -2,0.25; 4 -2,-0.25; 5 -2,-0.75; 6 -2,-1.25; 13 2,-1.25; 14 2,-0.75; 15 2,-0.25; 16 2,0.25; 17 2,0.75; 18 2,1.25 | smd 0.3 x 0.8: 7 -1.25,-2; 8 -0.75,-2; 9 -0.25,-2; 10 0.25,-2; 11 0.75,-2; 12 1.25,-2; 19 1.25,2; 20 0.75,2; 21 0.25,2; 22 -0.25,2; 23 -0.75,2; 24 -1.25,2 | smd 2.7 x 2.7: 25 0,0
QFN16_3X3_RFX2401C = smd 0.65 x 0.25: 1 -1.425,0.75; 2 -1.425,0.25; 3 -1.425,-0.25; 4 -1.425,-0.75; 9 1.425,-0.75; 10 1.425,-0.25; 11 1.425,0.25; 12 1.425,0.75 | smd 0.25 x 0.65: 5 -0.75,-1.425; 6 -0.25,-1.425; 7 0.25,-1.425; 8 0.75,-1.425; 13 0.75,1.425; 14 0.25,1.425; 15 -0.25,1.425; 16 -0.75,1.425 | smd 1.7 x 1.7: 17 0,0
XTAL2016_4P = smd 0.9 x 0.8: 1 -0.7,-0.55; 2 0.7,-0.55; 3 0.7,0.55; 4 -0.7,0.55

### Placement (x,y rotation side)
C1  14.6,8.6 0 bottom
C2  5.8,3.5 90 top
C3  3.1,10.1 0 bottom
C4  3.1,11.2 0 bottom
C6  18.65,24.2 90 bottom
C7  17.6,24.2 270 bottom
C8  16.3,21.9 0 bottom
C9  12.8,26.6 0 bottom
C10  15.5,27.2 0 bottom
C11  8.75,21.8 0 bottom
C12  14.2,11.25 0 bottom
C13  17.2,25.1 0 top
C14  15.3,25.3 90 top
C19  18.1,7.3 0 bottom
C20  15.2,28.1 90 top
C21  8.85,14.55 90 bottom
C22  7.95,14.35 90 bottom
C23  3,18.3 90 bottom
C24  3,15.55 90 bottom
C25  6,23.5 180 bottom
C26  9.85,16.55 90 bottom
C27  10.7,20.15 270 bottom
C28  12.1,19.2 180 bottom
C29  10.6,16.46 90 bottom
C30  11.65,16.75 180 bottom
C31  14.13,13.15 90 bottom
C32  15.13,13.15 90 bottom
C33  17.21,15.35 180 bottom
C34  19.11,15.35 0 bottom
C35  17.21,12.75 180 bottom
C36  19.11,12.75 0 bottom
C37  17.1,10.1 180 bottom
D1  8.5,10.4 0 bottom
F1  17.9,5 270 bottom
FB1  5.7,21.7 180 bottom
FB2  11.8,13 270 bottom
J1  12,0 0 top
J2  21,28.45 0 bottom
J3  11.95,4.5 0 bottom
J5  21.75,16 90 top
L1  13,23.9 90 bottom
L2  2.8,21.2 90 bottom
L3  10.35,18.25 180 bottom
L4  12.1,18.25 180 bottom
L5  18.16,14.05 270 bottom
L6  18.16,11.45 270 bottom
LED1  13.2,28.1 0 top
R1  5.8,6.5 90 top
R2  18.3,6 90 top
R3  5.8,1.5 90 top
R4  5.1,10.1 0 bottom
R5  5.1,11.2 0 bottom
R9  14.4,21.9 0 bottom
R10  18.2,21.9 0 bottom
R11  18.1,8.38 0 bottom
R12  13.8,25.45 90 top
R13  20.8,9.5 90 top
R14  5.25,25.4 0 top
R15  3,21.5 90 top
R16  3,13.55 90 bottom
R17  13.63,20 270 bottom
R18  15.04,20 270 bottom
R19  12.3,21.2 180 bottom
R20  16.18,18.7 0 bottom
R22  10.5,7.1 0 bottom
R23  13.5,7.1 0 bottom
R24  18.7,9.3 180 bottom
R26  10.7,25.25 90 top
R27  22.2,9.5 90 top
R28  12.5,25.45 90 top
SW1  19.9,28.2 0 top
SW2  7.35,28.35 180 top
TP1  19,2.5 0 bottom
TP2  18.3,27.75 0 bottom
TP3  5.5,8.5 0 bottom
TP4  1.5,10.5 0 bottom
TP5  22.6,21.2 0 top
TP6  20.8,21.2 0 top
TP7  7.5,23 0 bottom
TP8  9.1,23 0 bottom
TP9  1.5,8.5 0 bottom
TP10  3.5,8.5 0 bottom
U2  15.7,24.4 0 bottom
U3  12,16.85 270 top
U4  6.9,18.1 90 bottom
U5  14.38,16 180 bottom
Y1  5.26,14.35 0 bottom

### Tracks (layer width: path | path; a pad name or v marks a point on that pad's centre or on a via)
3V3  (via drill 0.3, 0.3 pad 0.5)
  Top 0.25: v13.12,22 14.62,22 14.75,22.12 | 14.75,22.12 16.25,23.62 U3.3 | 14.75,22.12 v15.75,21.12 | v16,28.75 15.38,28.75 15.25,28.62 C20.2 | C13.2 v18.1,26 | v20.65,13.1 21.3,12.45 21.35,12.45 21.4,12.4 21.45,12.4 21.5,12.35 21.55,12.35 21.6,12.3 21.65,12.3 21.7,12.25 J5.1 | C14.2 15.23,25.83 13.92,25.83 13.85,25.9 R12.2 13.78,26.04 13.78,26.45 12.74,27.49 12.4,27.49 LED1.4 10.8,29.04 v10.8,29.1 | R26.2 10.63,25.73 10.35,25.45 v9.35,25.45 | v6.5,25.35 R14.2
  Route2 0.25: v12.75,14.12 13.5,14.88 v13.5,21.2 | v13.5,21.2 13.5,21.62 v13.12,22 | v10.12,6.25 10.75,5.62 10.75,4.75 | v12,5.75 12,2.75 | 15.5,29.25 16,29.25 v16,28.75 | 15.5,29.25 9.25,29.25 7.9,29.25 v7.9,27.9 5.88,25.88 5.88,23.88 v4,22 1.88,19.88 1.88,13.5 1.37,13 1.37,8.88 4.12,6.12 4.12,5.42 4.79,4.75 10.75,4.75 | v15.75,21.12 15.5,21.38 15.5,29.25 | v13.5,21.2 13,21.7 11.59,21.7 10.5,22.79 10.5,23.25 10.7,23.45 10.7,25.9 | 21.2,12.4 21.2,12.55 v20.65,13.1 | 6.05,25.25 6.1,25.3 6.15,25.3 6.2,25.35 v6.5,25.35 | 12,2.75 13.96,2.75 14.38,3.17 14.38,4.25 v15.62,5.56 | 12,2.75 11.29,2.75 10.75,3.29 10.75,4.75
  Route15 0.25: v13.5,21.2 12.9,21.8 12.9,22.43 10.09,25.25 9.55,25.25 v9.35,25.45
  Bottom 0.25: v13.12,22 13.88,22 R9.2 | v15.75,21.12 15.75,21.88 C8.2 | v12.75,14.12 12.12,14.12 11.88,13.88 FB2.1 | v10.12,6.25 10.12,7 R22.2 | v12,5.75 13,6.75 13,7 R23.2 13.66,7.75 15.38,7.75 16,8.38 R11.2 | J3.1 16.38,4.5 16.38,5.25 15.88,5.25 v15.62,5.56 | L1.2 13,24.75 12.75,24.75 12.75,25.62 11.88,26.5 C9.2 11.25,26 10.38,26 v7.9,27.9 | FB1.1 4.62,22 v4,22 | C10.2 15.12,27.31 15.12,27.88 v16,28.75
  pour Route2 (isolate 0.15, no thermals): 0.3,0.3 23.7,0.3 23.7,29.7 0.3,29.7
3V3_PA
  Bottom 0.25: C12.2 12.62,11.88 12.12,11.88 11.88,12.12 FB2.2 12.47,12.22 13.88,13.63 C31.2 | U5.16 13.75,14.5 13.75,14.12 14.12,13.75 C31.2 | C31.2 14.25,13.62 14.75,13.62 | 14.75,13.62 14.75,14.5 U5.14 | 14.75,13.62 C32.2
3V3_RADIO  (via drill 0.3 pad 0.5)
  Route2 0.25: v3.75,13.12 2.75,14.13 2.75,20 6.5,23.75 v6.5,24.62
  Bottom 0.25: R16.1 3,13.12 v3.75,13.12 | FB1.2 6.47,23.49 C25.2 v6.5,24.62 | FB1.2 6.5,21.62 6.62,21.62 | U4.15 6.62,20.12 6.62,21.62 | 6.62,21.62 FB1.2 | 6.62,21.62 7.75,21.62 7.88,21.75 C11.2
BUCK_FB  (via drill 0.3)
  Route2 0.2: v14.5,21.12 15.25,21.12 15.25,20.88 15.5,20.62 16.5,20.62 v16.5,21.12 16.5,25.12 v17.38,26
  Bottom 0.2: v14.5,21.12 14.88,21.12 14.88,21.88 R9.1 | 17.06,21.69 17.25,21.88 17.62,21.88 R10.2 | 17.06,21.69 v16.5,21.12 | 17.06,21.69 16.88,21.88 C8.1 | v17.38,26 17.12,26 16.75,25.62 U2.5
BUCK_SW
  Bottom 0.25: U2.3 14.62,23.12 13,23.12 L1.1
ESP_EN  (via drill 0.3)
  Top 0.2: U3.45 18,9.8 18,9.73 19.23,8.5 v19.38,8.5
  Route2 0.2: v19.62,4.62 19.62,8.25 v19.38,8.5
  Bottom 0.2: 18.62,8.38 17.62,7.38 C19.2 | v19.38,8.5 19.25,8.38 18.62,8.38 | 18.62,8.38 R11.1 | TP1.1 19,3.25 19.62,3.88 v19.62,4.62
ESP_IO0  (via drill 0.3, 0.3 pad 0.5)
  Top 0.15: SW1.2 22.09,28.18 21.95,28.05 21.19,28.05 v19.25,26.11 | v12.33,22.3 12.53,22.51 13.3,22.51 14.13,23.34 | 14.13,23.34 14.13,24.64 R12.1 | U3.4 15.4,23.81 14.83,23.25 14.22,23.25 14.13,23.34
  Route15 0.15: v12.33,22.3 12.33,21.73 13.39,20.67 14.69,20.67 15.1,21.08 15.1,21.95 v19.25,26.11
  Bottom 0.15: v19.25,26.11 18.7,27.2 TP2.1
FEM_RXEN
  Bottom 0.2: R18.2 15.12,19.5 15.12,19.25 15.25,19.25 15.75,18.75 R20.2 15,18 14.44,18 14.25,17.81 14.25,17.54 U5.6
FEM_TXEN
  Bottom 0.2: U5.5 R17.2 13.25,19.5 13,19.75 12.75,19.75 12.38,20.12 12.12,20.12 12.12,20.5 12.79,21.16 R19.2
GND  (via drill 0.2 pad 0.45, 0.3 pad 0.5)
  Top 0.2: J1.A1B12 v8.25,9.09
  Bottom 0.2: C26.1 9.1,16.07 v8.75,16.41 | C27.1 11.25,20.64 v11.3,20.59 | C29.1 10.6,15.63 v9.49,14.53 | C33.1 16.73,15.15 16.38,14.8 16.13,14.8 v15.73,14.4 | C34.1 v20.2,15.35 | C35.1 16.73,13 17.13,13.4 v17.18,13.4 | C36.1 20.1,12.75 v20.2,12.65 | C21.1 9.85,14.06 v9.9,14.12 | C22.1 v7.35,13.87 | Y1.2 v3.81,13.8 | C25.1 5.46,23.5 v4.42,24.55 | C9.1 14.4,26.6 14.45,26.55 14.5,26.55 v14.55,26.5 | D1.2 v8.25,9.09 | v20.15,9.2 20.8,8.8
  other vias: 12.75,26.75 19.12,5.62 3.5,12 4.12,23.88 16.12,28 10.38,27.12 9.12,16 14.75,2.75 20.64,7.13 14.33,19.53 1.35,19.2 3.75,16.25 20.5,13.75 16.2,11.63 16.2,14.68 14.04,15.5 14.88,15.5 14.04,16.5 14.88,16.5 6.1,17.3 7.7,17.3 6.8,18.9 7.7,18.9 7,18.1 20.4,11.57 16.53,17 15.2,7.18 19.9,10.5 22.1,11.1 22.8,17.5 22.6,22.2 20.8,22.5 23.3,28 18.6,29 22.3,26.75
  pour Route15 (isolate 0.2, no thermals): 0.2,0.2 23.8,0.2 23.8,29.8 0.2,29.8
  pour Top (isolate 0.2, no thermals): 0.3,0.3 23.7,0.3 23.7,29.7 0.3,29.7
  pour Bottom (isolate 0.2, no thermals): 0.28,0.28 23.73,0.28 23.73,29.73 0.28,29.73
GPIO35  (via drill 0.3)
  Top 0.2: v5.88,12 6.75,12 8.38,13.62 14.25,13.62 v17.38,16.75 | v20.38,16.12 21.25,15.25 J5.3 | U3.31 6,9.8 6,9.73 5.49,9.22 4.28,9.22 v4.12,9.38
  Route2 0.2: v4.12,9.38 5.88,11.12 v5.88,12
  Bottom 0.2: v17.38,16.75 18,16.12 v20.38,16.12
GPIO36  (via drill 0.3 pad 0.5)
  Top 0.2: v4.25,6.75 6.88,9.38 6.88,9.75 U3.32 | J5.4 22.25,16.75 v22.88,16.12
  Bottom 0.2: v4.25,6.75 6.5,4.5 6.5,2.25 7.43,1.32 19.94,1.32 23.13,4.51 23.13,15.87 v22.88,16.12
GPIO37  (via drill 0.3 pad 0.5)
  Top 0.15: v10.1,12.25 8.85,11 8.84,11 7.75,9.91 U3.33 | v20.45,17.35 21.35,18.25 J5.5
  Route2 0.15: v10.1,12.25 10.95,13.1 16.2,13.1 v20.45,17.35
GPIO38  (via drill 0.2 pad 0.45, 0.3 pad 0.5)
  Top 0.15: v9,10.56 8.8,10.4 8.8,10.25 8.75,10.2 8.75,10.15 8.7,10.1 8.7,10.05 8.65,10 8.65,9.95 8.6,9.9 U3.34 | v19.85,17.85 J5.6
  Route2 0.15: v15.86,13.7 19.85,17.69 v19.85,17.85
  Route15 0.15: v9,10.56 10.2,11.8 12.9,11.8 13.8,12.7 14.86,12.7 | 14.86,12.7 v15.86,13.7 14.86,12.7
I2C_SCL  (via drill 0.3 pad 0.5)
  Top 0.2: U3.30 5.1,11 6.25,11 7.98,12.73 10.3,12.73 12.25,10.78 v12.25,10.75
  Route2 0.2: v11.38,3.38 11.38,5.88 12.85,7.35 12.85,10.15 v12.25,10.75
  Bottom 0.2: 11.38,2.75 10.65,2.75 8.95,4.45 J3.6 | 11.38,2.75 v11.38,3.38 | R23.1 13.98,5.51 14.23,5.27 14.23,3.05 13.93,2.75 11.38,2.75
I2C_SDA  (via drill 0.3 pad 0.5)
  Top 0.2: v4.88,5.38 3.02,7.23 3.02,12.2 3.3,12.48 3.7,12.48 4.42,11.75 U3.29
  Route2 0.2: v9.62,5.56 9.27,5.15 7.6,5.15 7.38,5.38 v4.88,5.38
  Bottom 0.2: J3.5 10.88,4.5 10.88,5.75 | 10.88,5.75 10.88,7 R22.1 | 10.88,5.75 9.88,5.75 v9.62,5.56
JTAG_TCK  (via drill 0.3)
  Top 0.2: v10.25,11.12 9.5,10.38 9.5,9.88 U3.35
  Route2 0.2: v10.25,11.12 7.5,11.12 6.15,12.48 2.35,12.48 v1.88,12
  Bottom 0.2: TP9.1 0.77,9.23 0.77,10.9 v1.88,12
JTAG_TDI  (via drill 0.3 pad 0.5)
  Top 0.2: v11.62,9 11.25,9.38 11.25,9.75 U3.37
  Route2 0.2: v7,8 7.05,8.05 8.45,8.05 8.59,7.91 10.69,7.91 11,8.22 11,8.38 v11.62,9
  Bottom 0.2: v7,8 6.62,8.38 5.62,8.38 TP3.1
JTAG_TDO  (via drill 0.3 pad 0.5)
  Top 0.2: U3.36 10.38,9.88 10.38,10.25 v10.75,10.62
  Route2 0.2: v10.75,10.62 9.02,8.9 8.72,8.6 5.2,8.6 4.9,8.9 2.6,8.9 v1.88,9.62
  Bottom 0.2: v1.88,9.62 1.5,10 TP4.1
JTAG_TMS  (via drill 0.3 pad 0.5)
  Top 0.2: U3.38 12,9.38 v12.38,9
  Route15 0.2: v8.38,5.62 8.85,5.6 9.4,5.05 9.85,5.05 11.9,7.1 11.9,8.53 v12.38,9
  Bottom 0.2: TP10.1 3.62,8.5 4.38,7.75 5.12,7.75 7.37,5.5 8.25,5.5 v8.38,5.62
LED_DATA  (via drill 0.3 pad 0.5)
  Top 0.15: R15.1 2.87,21.15 v2.25,21.15 | v3.7,14.6 4.25,14.6 4.8,15.15 U3.25
  Route15 0.15: v3.7,14.6 2.25,16.05 v2.25,21.15
LED_DIN
  Top 0.15: LED1.3 12.15,28.65 11.25,29.55 4.97,29.55 1.02,25.61 1.02,24.38 3,22.4 R15.2
PA_RXEN  (via drill 0.3)
  Top 0.2: v20,20.5 20.7,21.2 TP6.1 | v10.38,22.12 9.5,23 9.5,23.8 U3.11
  Route2 0.2: v20,20.5 19.8,20.3 14.65,20.3 14,20.95 14,26.18 12.57,27.6 10.18,27.6 9.9,27.32 9.9,22.6 v10.38,22.12
  Bottom 0.2: v20,20.5 15.12,20.5 R18.1
PA_TXEN  (via drill 0.3)
  Top 0.2: U3.10 10.38,23.75 10.38,22.88 v12.88,20.38 13,20.5 16.88,20.5 v17.38,21 | TP5.1 22.05,21.2 v21.5,21.75
  Bottom 0.2: v12.88,20.38 13.62,20.38 R17.1 | v21.5,21.75 20.75,21 v17.38,21
RADIO_BUSY  (via drill 0.3)
  Top 0.2: U3.13 7.75,24.5 7.5,24.75 v7.38,24.62
  Route2 0.2: v4,16.88 6.75,19.62 6.75,23.5 7.38,24.12 v7.38,24.62
  Bottom 0.2: v4,16.88 4.88,16.88 U4.7 | v7.38,24.62 7.38,23 TP7.1
RADIO_DIO1  (via drill 0.3 pad 0.5)
  Top 0.2: v8.25,24.75 8.5,24.5 8.5,23.88 U3.12
  Bottom 0.2: U4.8 3.48,17.35 3.42,17.29 2.59,17.29 0.9,18.98 0.9,25.52 1.88,26.5 6.25,26.5 8.06,24.69 | 8.06,24.69 8.12,24.75 v8.25,24.75 | TP8.1 9.25,23 9.25,23.5 8.06,24.69
RADIO_MISO  (via drill 0.3)
  Top 0.2: v7.25,21 6.12,21 5.25,21.88 5.08,21.88 U3.17
  Bottom 0.2: v7.25,21 7.25,20.12 U4.16
RADIO_MOSI  (via drill 0.3)
  Top 0.2: v8.5,20.88 8.5,21.25 6.05,23.7 U3.15
  Bottom 0.2: v8.5,20.88 7.75,20.88 7.75,20.12 U4.17
RADIO_NRESET  (via drill 0.3 pad 0.5)
  Top 0.15: v7.15,15.3 6.05,20.09 5.09,21.05 5.05,21.05 U3.18
  Bottom 0.15: v7.15,15.3 U4.3
RADIO_NSS  (via drill 0.3 pad 0.5)
  Top 0.15: v9.3,20.35 9.3,21.25 7.05,23.5 7.05,23.55 7,23.6 7,23.65 6.95,23.7 6.95,23.75 6.9,23.8 | v5.05,24.65 R14.1
  Top 0.2: U3.14 6.9,23.8 6.9,23.73 v9.5,20.88
  Route15 0.15: v5.05,24.65 5.36,24.65 9,21.01 v9.3,20.35
  Bottom 0.2: U4.19 9.5,19.95 v9.5,20.88
RADIO_SCK  (via drill 0.3)
  Top 0.2: U3.16 5.05,22.75 6.17,22.75 8,20.93 8,20.7 8.7,20 v8.75,20
  Bottom 0.2: v8.75,20 8.62,20.12 8.25,20.12 U4.18
RF_ANT0
  Bottom 0.15: 18.12,15.25 18.12,14.62 L5.1 | 18.12,15.25 17.75,15.25 C33.2 | 18.12,15.25 18.25,15.25 | 18.25,15.25 18.62,15.25 C34.2 | 18.25,15.25 17.25,16.25 U5.10
RF_ANT1
  Bottom 0.15: 18.12,12.75 18.12,12 L6.1 | C35.2 18.12,12.75 | 18.12,12.75 C36.2 | 18.12,12.75 18.12,13.5 L5.2
RF_ANT2
  Bottom 0.15: R24.1 18.25,9.38 17.62,10 C37.2 17.62,10.12 17.62,10.38 18.12,10.88 L6.2
RF_FEM
  Bottom 0.15: U5.4 C30.2
RF_M1
  Bottom 0.15: L3.2 L4.1 C28.1 11.5,19.25 11.38,19.25 11.12,19.5 10.88,19.5 10.75,19.62 C27.2
RF_M2
  Bottom 0.15: C28.2 L4.2 11.16,16.83 C30.1 10.96,16.95 C29.2
RF_SX
  Bottom 0.15: U4.22 9,17.88 9.88,17.88 | C26.2 9.88,17.12 9.88,17.88 | L3.1 9.88,17.88
RF_UFL
  Bottom 0.15: R24.2 19.25,9.38 19.38,9.5 19.5,9.5 20,10 20.25,10 22.1,11.85 22.1,22.25 19.85,24.5 19.85,25.6 J2.SIG
ROLE_SEL  (via drill 0.3)
  Top 0.2: R26.1 10.59,24.88 v9,24.88 8,25.88 7.28,26.6 SW2.2 | v11,23 11.22,23 12,23.78 U3.8
  Bottom 0.2: v11,23 9.12,24.88 v9,24.88
STRAP_IO3  (via drill 0.3)
  Top 0.2: v11.62,22.62 12.12,23.12 12.2,23.12 12.85,23.78 U3.7 | v10.88,26.62 11.81,26.62 R28.2
  Route2 0.2: v10.88,26.62 11.62,25.88 v11.62,22.62
STRAP_IO45
  Top 0.2: U3.41 14.55,9.47 14.89,9.12 16.62,9.12 18.08,7.67 22.51,7.67 23.33,8.49 23.33,9.79 22.61,10.51 21.32,10.51 R13.2
STRAP_IO46
  Top 0.2: U3.44 17.1,9.78 18.86,8.02 22.14,8.02 22.75,8.63 22.75,9.44 R27.2
SX_DCC_SW
  Bottom 0.2: U4.14 6.12,20.12 6.12,20.75 5.62,21.25 5.62,22.25 4.99,22.88 1.98,22.88 1.77,22.67 1.77,20.95 2.48,20.25 L2.1
SX_VBATIO  (via drill 0.3)
  Route2 0.2: v3.75,18.12 3.25,17.62 v3.25,16.75
  Bottom 0.2: 2.5,16 3,16 C24.2 | R16.2 3,14.12 2.45,14.67 2.45,15.95 2.5,16 | v3.75,18.12 4.38,18.75 4.88,18.75 U4.11 | 2.5,16 v3.25,16.75
SX_VDCC  (via drill 0.3 pad 0.5)
  Route15 0.25: v4.05,19.15 5.8,15.94 7.09,14.65 v7.2,14.65
  Bottom 0.15: v4.05,19.15 3.85,19.25
  Bottom 0.25: L2.2 2.8,22.1 3.85,21.05 3.85,19.25 | 7.7,15.45 7.7,16 7.65,16.05 | 7.7,15.45 7.7,15.09 C22.2 | U4.12 4.85,19.35 4.8,19.3 4.4,19.3 4.25,19.15 | v7.2,14.65 7.65,15.05 7.65,15.1 7.7,15.45 | U4.2 7.65,16.05 | 4.25,19.15 3.2,18.8 C23.2 | 4.25,19.15 v4.05,19.15 | 7.7,15.45 7.65,16.05
SX_VRPA
  Bottom 0.2: C21.2 8.75,15.12 8.62,15.25 8.5,15.25 8.25,15.5 8.25,16 U4.1
SX_XTA
  Bottom 0.15: U4.4 6.65,14.4 6.1,13.85 6.05,13.85 6,13.8 Y1.1
SX_XTB
  Bottom 0.2: Y1.3 5.65,15.98 U4.6
U0RXD  (via drill 0.3)
  Top 0.2: v14.25,10.75 13.75,10.25 13.75,9.88 U3.40
  Route2 0.2: v14.25,10.75 13.88,10.38 13.88,7 12.62,5.75 v12.62,3.5
  Bottom 0.2: v12.62,3.5 12,4.12 12,4.5 J3.4
U0TXD  (via drill 0.3)
  Top 0.2: v14.25,11.5 12.88,10.12 12.88,9.88 U3.39
  Route2 0.2: v13.75,3.25 13.75,6.38 14.73,7.35 14.73,11.02 v14.25,11.5
  Bottom 0.2: v13.75,3.25 13.75,4.5 J3.3
USB_CC1  (via drill 0.2 pad 0.45, 0.3 pad 0.5)
  Top 0.2: R1.2 5.75,7 5.7,6.95 v5.12,6.95 | J1.A5 10.7,7.4 10.7,7.45 10.65,7.5 10.65,8.25 v10.5,8.4
  Route15 0.2: v10.5,8.4 10.35,8.55 6.72,8.55 v5.12,6.95
USB_CC2
  Top 0.2: R2.2 18.25,6.54 18.25,7 16.65,8.6 14.45,8.6 13.75,7.9 J1.B5
USB_DN  (via drill 0.3 pad 0.5)
  Top 0.2: 12.19,6.69 12.25,6.75 J1.A7 | 12.19,6.69 14.88,4 16.45,4 17.25,3.2 v17.25,3.12 | 12.19,6.69 12.05,6.55 11.51,6.55 11.25,6.81 J1.B7
  Route2 0.2: v13.38,8.5 13.38,11.3 14.05,11.98 14.45,11.98 17.05,9.38 17.05,5.6 16.85,5.4 16.85,4.6 17.1,4.35 17.1,3.27 v17.25,3.12
  Bottom 0.2: R5.1 5.63,11.25 7.25,11.25 D1.4 D1.3 7.62,9.15 7.62,8.58 8.31,7.89 12.76,7.89 v13.38,8.5
USB_DP  (via drill 0.3 pad 0.5)
  Top 0.2: J1.A6 11.75,8 12,8.25 12.4,8.25 | 12.4,8.25 v12.4,8.35 | 12.4,8.25 12.5,8.25 12.75,8 J1.B6
  Route15 0.2: v12.4,8.35 12.9,8.85 12.9,9.05 12.75,9.35 12,10.1 8.85,10.1 8.75,10.15 8.55,10.35 8.5,10.45 8.5,11.03 v6.75,10.75
  Bottom 0.2: v12.4,8.35 12.9,8.85 12.9,9.2 12.35,9.75 10.9,9.75 9.45,11.2 | D1.1 9.45,11.2 | 9.45,11.2 D1.6 | v6.75,10.75 R4.1
USB_MCU_DN  (via drill 0.3)
  Top 0.2: v1.25,13.62 1.5,13.88 1.5,15.68 3.18,17.35 4.2,17.35 4.7,16.85 U3.23
  Bottom 0.2: 2.62,12.38 2.62,11.25 C4.2 | v1.25,13.62 2.5,12.38 2.62,12.38 | R5.2 4.62,11.56 3.7,12.48 2.73,12.48 2.62,12.38
USB_MCU_DP  (via drill 0.3)
  Top 0.2: v1.88,7.62 2.38,8.12 2.38,13.95 4.42,16 U3.24
  Route2 0.2: v3.75,7.5 4.5,8.25 v4.5,8.38
  Bottom 0.2: 2.5,7.62 2.5,7.5 v3.75,7.5 | 2.5,7.62 2.5,10 C3.2 | v4.5,8.38 4.5,9 4.62,9.12 R4.2 | 2.5,7.62 v1.88,7.62
USB_SHIELD
  Top 0.2: 6.44,3.81 7.62,2.62 J1.S1T 7.08,2 5.82,2 R3.2 | 6.44,3.81 6.38,3.88 5.88,3.88 C2.2 | 6.44,3.81 7.68,5.05 J1.S3T
  Route2 0.2: J1.S2T J1.S4T
  Bottom 0.2: J1.S2T 16.25,2.53 16.25,2.33 15.57,1.65 8.63,1.65 J1.S1T
VBUS  (via drill 0.3 pad 0.5)
  Top 0.25: v16.38,10.88 17.97,12.47 17.97,21.16 17.5,21.62 v17.5,22.62
  Route2 0.25: v15.38,2.12 15.38,1.3 18,1.3 v18,3.12 18,9.25 v16.38,10.88
  Bottom 0.25: v18,3.12 18,4 F1.2 | 15,25.62 15.12,25.62 16,26.5 18.31,26.5 18.62,26.18 18.62,25 C6.2 | 15,25.62 16.65,23.98 U2.1 16.75,23.25 17,23.5 17.38,23.5 17.5,23.62 C7.2 17.5,23.5 v17.5,22.62 | 15,25.62 14.75,25.62 U2.4 15,25.62 | C1.2 14,8.62 13.31,9.31 | 13.31,9.31 13.38,9.38 14.88,9.38 v16.38,10.88 | D1.5 8.62,11.68 8.62,11.93 9.45,12.75 10.31,12.75 10.75,12.31 10.75,11.54 12.16,10.12 12.5,10.12 13.31,9.31 | J3.7 7.45,4.43 9.76,2.12 v15.38,2.12
VBUS_IN  (via drill 0.3 pad 0.5)
  Top 0.25: v10.88,9 10.39,9 9.62,8.23 9.62,7.46 J1.A4B9 | J1.B9A4 14.38,7.41 14.38,6.88 14.14,6.64 14.14,5.97 15.11,5 v17.37,5 v17.38,5
  Route2 0.25: v10.88,9 11.62,9.75 11.62,10.84 13.12,12.33 16.3,12.33 v20.12,8.5
  Bottom 0.25: v17.38,5 18,5.62 18.12,5.62 F1.1 18,5.88 18.88,5 19.25,5 20,5.75 20.12,5.75 v20.12,8.5
(copper drawn outside any net)
  shapes: Route15 area x4, Route2 area x4

### Text on the board
tPlace: TX/RX | BOOT | RX | TX | 38 | 37 | 36 | 35 | G | TRANSCEIVER | 3V | AERIAL KIT | 2.4GHz | dev@nori.fish
bPlace: RF ANT | IO0 | BUSY | IRQ | TDO | TCK | TMS | TDI | REV A3 | RST | 5V | SCL | SDA | RX | TX | GND | 3V3